# Altium project Camera-Controller-Board.PrjPcb (part 8 of 18)

## Sheet RK3588-OSC-PLL-PMUIO.SchDoc
size 420 x 297 mm; SheetNumber: 5; SheetTotal: 22
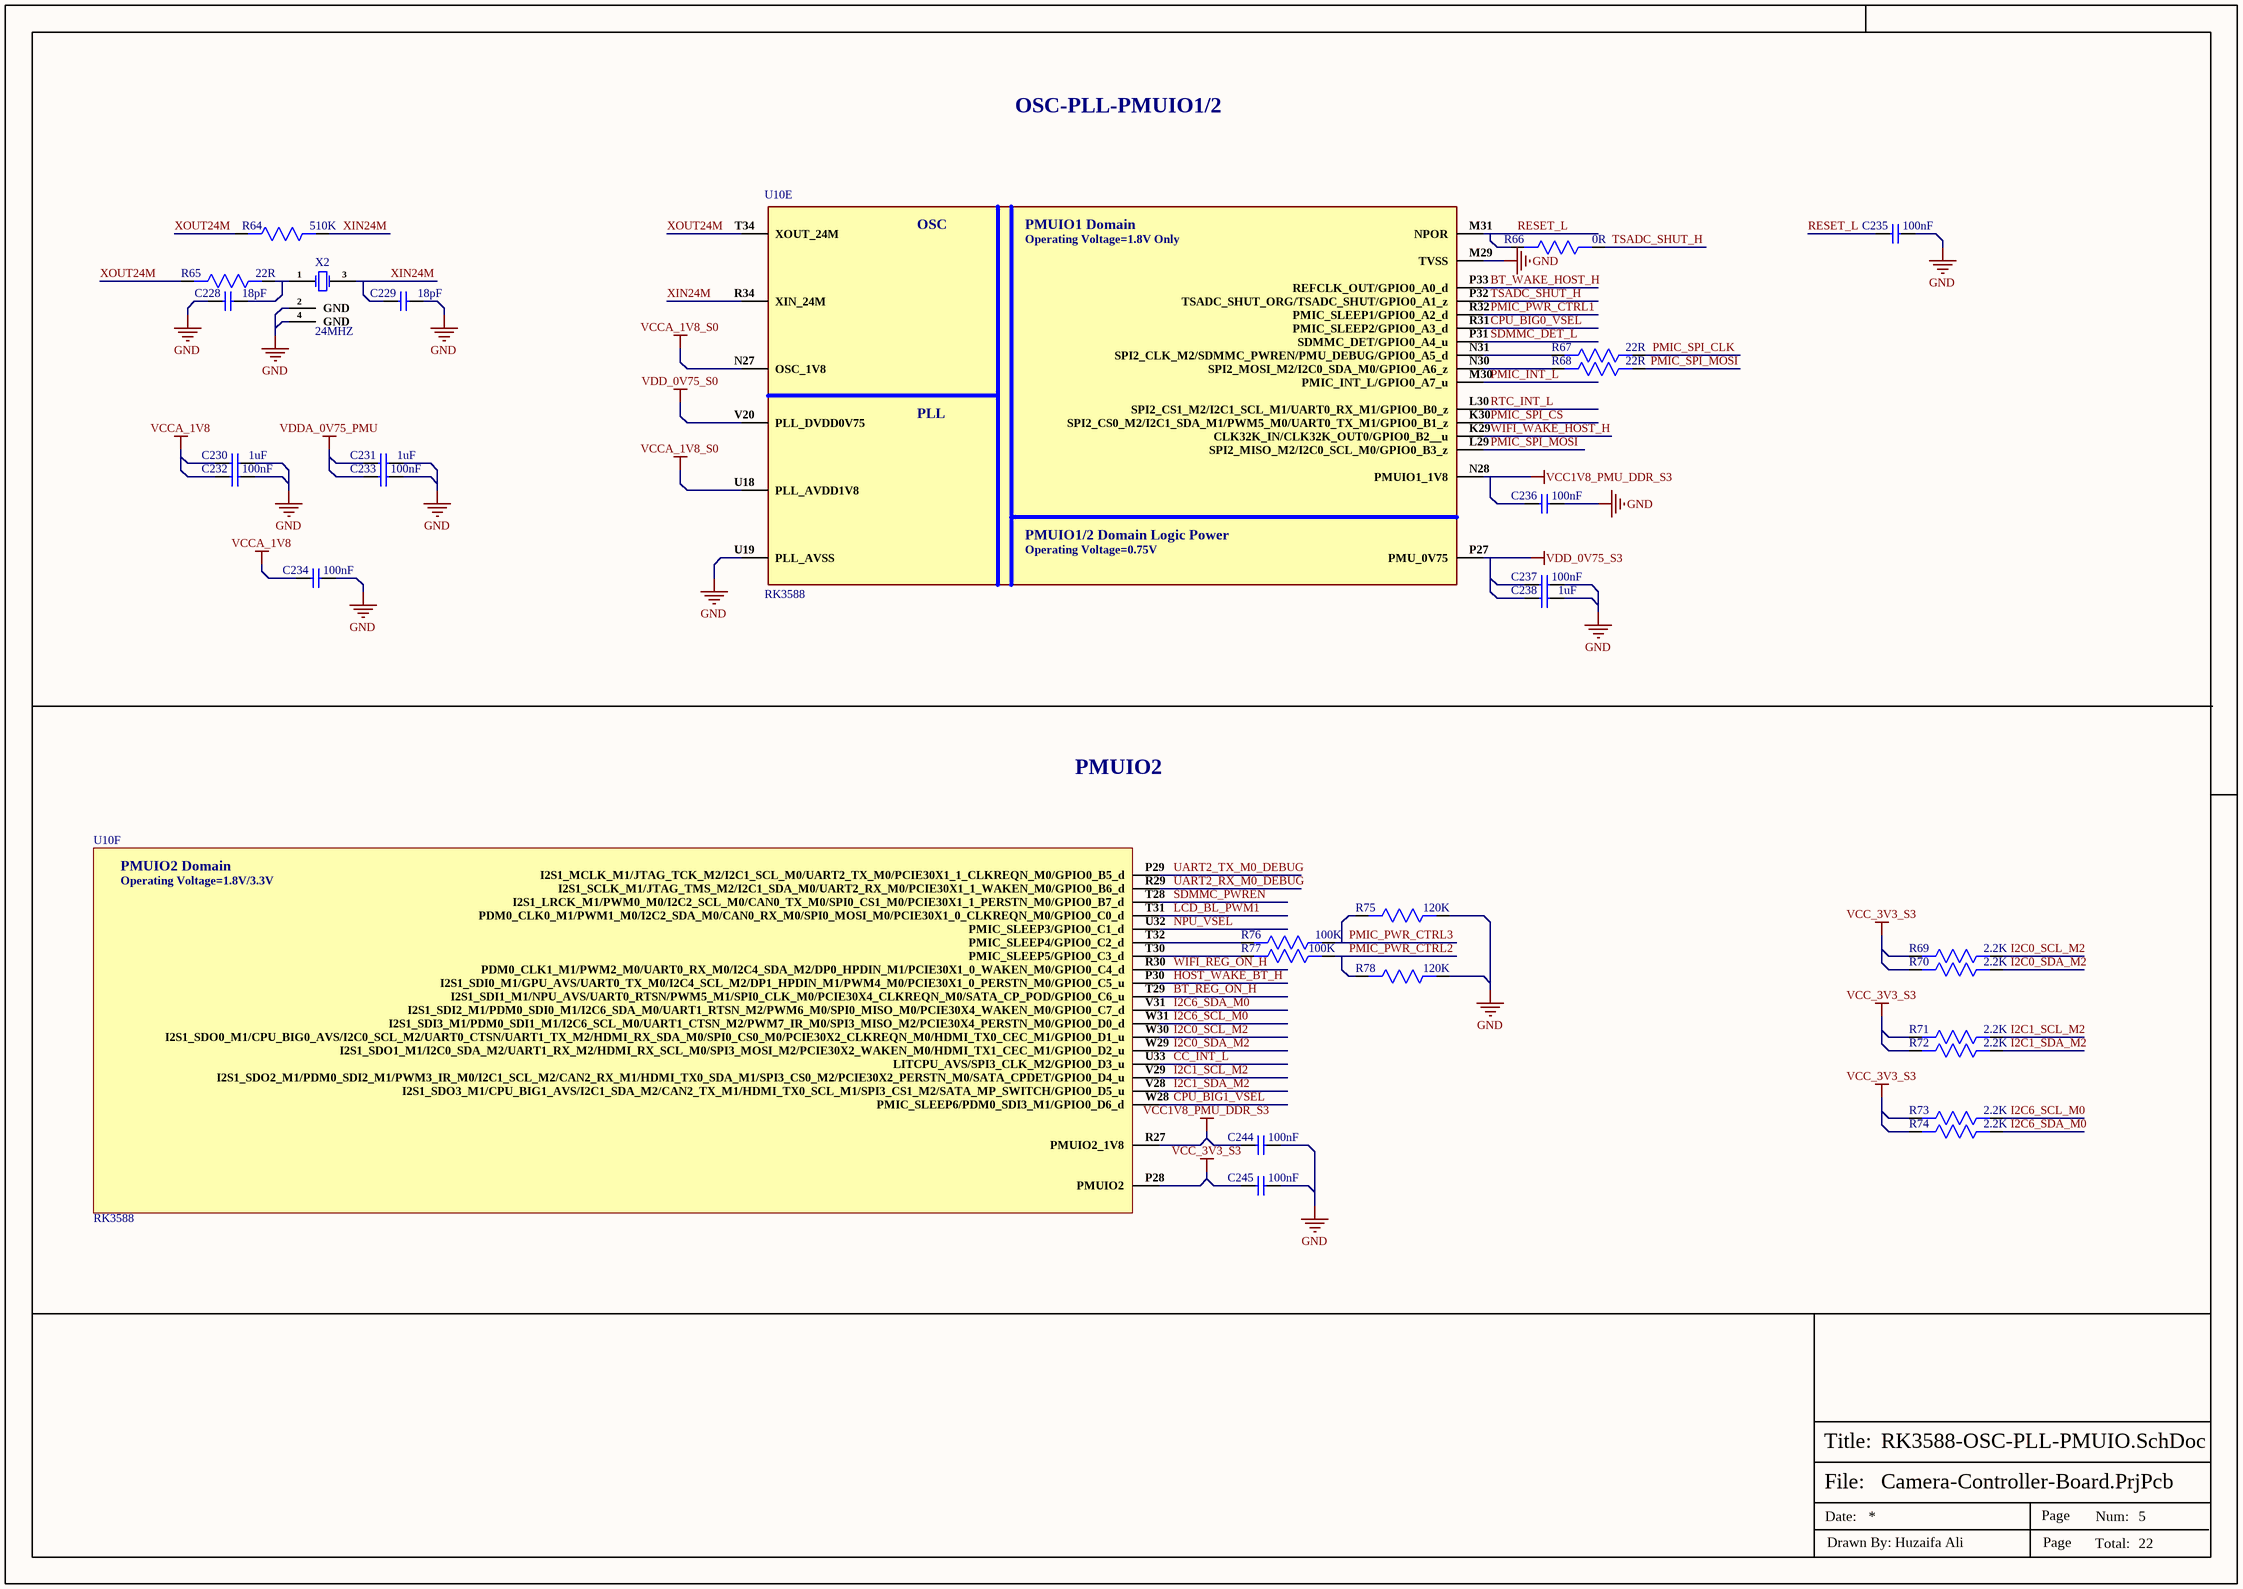
[diagram p4: RK3588-OSC-PLL-PMUIO.SchDoc]

### Parts
C228  18pF  [Cap-0402]
C229  18pF  [Cap-0402]
C230  1uF  [CAP-0201]
C231  1uF  [CAP-0201]
C232  100nF  [CAP-0201]
C233  100nF  [CAP-0201]
C234  100nF  [CAP-0201]
C235  100nF  [CAP-0201]
C236  100nF  [CAP-0201]
C237  100nF  [CAP-0201]
C238  1uF  [CAP-0201]
C244  100nF  [CAP-0201]
C245  100nF  [CAP-0201]
R64  510K  [Res-0402]
R65  22R  [Res-0402]
R66  0R  [Res-0201]
R67  22R  [Res-0402]
R68  22R  [Res-0402]
R69  2.2K  [Res-0201]
R70  2.2K  [Res-0201]
R71  2.2K  [Res-0201]
R72  2.2K  [Res-0201]
R73  2.2K  [Res-0201]
R74  2.2K  [Res-0201]
R75  120K  [Res-0402]
R76  100K  [Res-0402]
R77  100K  [Res-0402]
R78  120K  [Res-0402]
U10  RK3588  [FCBGA-1088L]  (parts E,F of 26)
X2  24MHZ  [X322524MOB4SI-]

### Nets
GND: C228.1 C229.2 C230.2 C231.2 C232.2 C233.2 C234.2 C235.2 C236.2 C237.2 C238.2 C244.2 C245.2 R75.1 R78.1 U10.M29(TVSS) U10.U19(PLL_AVSS) X2.2(GND) X2.4(GND)
VCC1V8_PMU_DDR_S3: C236.1 C244.1 U10.N28(PMUIO1_1V8) U10.R27(PMUIO2_1V8)
VCC_3V3_S3: C245.1 R69.2 R70.2 R71.2 R72.2 R73.2 R74.2 U10.P28(PMUIO2)
VCCA_1V8: C230.1 C232.1 C234.1
VCCA_1V8_S0: U10.N27(OSC_1V8) U10.U18(PLL_AVDD1V8)
VDD_0V75_S0: U10.V20(PLL_DVDD0V75)
VDD_0V75_S3: C237.1 C238.1 U10.P27(PMU_0V75)
VDDA_0V75_PMU: C231.1 C233.1
BT_REG_ON_H: U10.T29(I2S1_SDI1_M1/NPU_AVS/UART0_RTSN/PWM5_M1/SPI0_CLK_M0/PCIE30X4_CLKREQN_M0/SATA_CP_POD/GPIO0_C6_u)
BT_WAKE_HOST_H: U10.P33(REFCLK_OUT/GPIO0_A0_d)
CC_INT_L: U10.U33(LITCPU_AVS/SPI3_CLK_M2/GPIO0_D3_u)
CPU_BIG0_VSEL: U10.R31(PMIC_SLEEP2/GPIO0_A3_d)
CPU_BIG1_VSEL: U10.W28(PMIC_SLEEP6/PDM0_SDI3_M1/GPIO0_D6_d)
HOST_WAKE_BT_H: U10.P30(I2S1_SDI0_M1/GPU_AVS/UART0_TX_M0/I2C4_SCL_M2/DP1_HPDIN_M1/PWM4_M0/PCIE30X1_0_PERSTN_M0/GPIO0_C5_u)
I2C0_SCL_M2: R69.1 U10.W30(I2S1_SDO0_M1/CPU_BIG0_AVS/I2C0_SCL_M2/UART0_CTSN/UART1_TX_M2/HDMI_RX_SDA_M0/SPI0_CS0_M0/PCIE30X2_CLKREQN_M0/HDMI_TX0_CEC_M1/GPIO0_D1_u)
I2C0_SDA_M2: R70.1 U10.W29(I2S1_SDO1_M1/I2C0_SDA_M2/UART1_RX_M2/HDMI_RX_SCL_M0/SPI3_MOSI_M2/PCIE30X2_WAKEN_M0/HDMI_TX1_CEC_M1/GPIO0_D2_u)
I2C1_SCL_M2: R71.1 U10.V29(I2S1_SDO2_M1/PDM0_SDI2_M1/PWM3_IR_M0/I2C1_SCL_M2/CAN2_RX_M1/HDMI_TX0_SDA_M1/SPI3_CS0_M2/PCIE30X2_PERSTN_M0/SATA_CPDET/GPIO0_D4_u)
I2C1_SDA_M2: R72.1 U10.V28(I2S1_SDO3_M1/CPU_BIG1_AVS/I2C1_SDA_M2/CAN2_TX_M1/HDMI_TX0_SCL_M1/SPI3_CS1_M2/SATA_MP_SWITCH/GPIO0_D5_u)
I2C6_SCL_M0: R73.1 U10.W31(I2S1_SDI3_M1/PDM0_SDI1_M1/I2C6_SCL_M0/UART1_CTSN_M2/PWM7_IR_M0/SPI3_MISO_M2/PCIE30X4_PERSTN_M0/GPIO0_D0_d)
I2C6_SDA_M0: R74.1 U10.V31(I2S1_SDI2_M1/PDM0_SDI0_M1/I2C6_SDA_M0/UART1_RTSN_M2/PWM6_M0/SPI0_MISO_M0/PCIE30X4_WAKEN_M0/GPIO0_C7_d)
LCD_BL_PWM1: U10.T31(PDM0_CLK0_M1/PWM1_M0/I2C2_SDA_M0/CAN0_RX_M0/SPI0_MOSI_M0/PCIE30X1_0_CLKREQN_M0/GPIO0_C0_d)
NPU_VSEL: U10.U32(PMIC_SLEEP3/GPIO0_C1_d)
PMIC_INT_L: U10.M30(PMIC_INT_L/GPIO0_A7_u)
PMIC_PWR_CTRL1: U10.R32(PMIC_SLEEP1/GPIO0_A2_d)
PMIC_PWR_CTRL2: R77.1 R78.2
PMIC_PWR_CTRL3: R75.2 R76.1
PMIC_SPI_CLK: R67.1
PMIC_SPI_CS: U10.K30(SPI2_CS0_M2/I2C1_SDA_M1/PWM5_M0/UART0_TX_M1/GPIO0_B1_z)
PMIC_SPI_MOSI: R68.1 U10.L29(SPI2_MISO_M2/I2C0_SCL_M0/GPIO0_B3_z)
RESET_L: C235.1 R66.2 U10.M31(NPOR)
RTC_INT_L: U10.L30(SPI2_CS1_M2/I2C1_SCL_M1/UART0_RX_M1/GPIO0_B0_z)
SDMMC_DET_L: U10.P31(SDMMC_DET/GPIO0_A4_u)
SDMMC_PWREN: U10.T28(I2S1_LRCK_M1/PWM0_M0/I2C2_SCL_M0/CAN0_TX_M0/SPI0_CS1_M0/PCIE30X1_1_PERSTN_M0/GPIO0_B7_d)
TSADC_SHUT_H: R66.1 U10.P32(TSADC_SHUT_ORG/TSADC_SHUT/GPIO0_A1_z)
UART2_RX_M0_DEBUG: U10.R29(I2S1_SCLK_M1/JTAG_TMS_M2/I2C1_SDA_M0/UART2_RX_M0/PCIE30X1_1_WAKEN_M0/GPIO0_B6_d)
UART2_TX_M0_DEBUG: U10.P29(I2S1_MCLK_M1/JTAG_TCK_M2/I2C1_SCL_M0/UART2_TX_M0/PCIE30X1_1_CLKREQN_M0/GPIO0_B5_d)
WIFI_REG_ON_H: U10.R30(PDM0_CLK1_M1/PWM2_M0/UART0_RX_M0/I2C4_SDA_M2/DP0_HPDIN_M1/PCIE30X1_0_WAKEN_M0/GPIO0_C4_d)
WIFI_WAKE_HOST_H: U10.K29(CLK32K_IN/CLK32K_OUT0/GPIO0_B2__u)
XIN24M: C229.1 R64.1 U10.R34(XIN_24M) X2.3(CRYSTAL)
XOUT24M: R64.2 R65.2 U10.T34(XOUT_24M)
NetC228_2: C228.2 R65.1 X2.1(CRYSTAL)
NetR67_2: R67.2 U10.N31(SPI2_CLK_M2/SDMMC_PWREN/PMU_DEBUG/GPIO0_A5_d)
NetR68_2: R68.2 U10.N30(SPI2_MOSI_M2/I2C0_SDA_M0/GPIO0_A6_z)
NetR76_2: R76.2 U10.T32(PMIC_SLEEP4/GPIO0_C2_d)
NetR77_2: R77.2 U10.T30(PMIC_SLEEP5/GPIO0_C3_d)

### Notes on the sheet
- OSC-PLL-PMUIO1/2
- PMUIO2
- File:
- Title:
- Date:
- Page
- Num:
- Total:
- Drawn By: Huzaifa Ali
- (in symbol RK3588, part E) OSC; PMUIO1 Domain; Operating Voltage=1.8V Only; PLL; PMUIO1/2 Domain Logic Power; Operating Voltage=0.75V
- (in symbol RK3588, part F) PMUIO2 Domain; Operating Voltage=1.8V/3.3V

### Library data of the parts
C228 C229 = GRM1555C1H180FA01D: CAP CER 18PF 50V C0G/NP0 0402; Manufacturer: Murata; Material: Ceramic; Tolerance: 1%; Dielectric: C0G; Temperature Coefficient: 30ppm/°C; Supplier 1: Digi-Key; Manufacturer Part Number: GRM1555C1H180FA01D; RoHS: Yes; Category: Ceramic Capacitors; Stock 1: 2076194; Pricing 1: 1=0.10000, 10=0.06400, 50=0.03500, 100=0.02860, 500=0.02040, 1000=0.01603, 2500=0.01458, 5000=0.01341 (USD); Mount: Surface Mount; Case/Package: 0402; Case Code (Metric): 1005; Case Code (Imperial): 0402; Min Operating Temperature: -55°C; Max Operating Temperature: 125°C; Package Quantity: 1; Capacitance: 18pF; Voltage Rating: 50V; Packaging: Tape and Reel; Voltage Rating (DC): 50V; Termination: SMD/SMT; Voltage: 50V; Series: GRM; Construction: Flat; Length: 1mm; Width: 0.5mm; Height: 0.5mm; Thickness: 0.022inch; Depth: 0.5mm; Radiation Hardening: No; Reach SVHC Compliant: Yes; Lead Free: Lead Free; RoHS Compliant: Yes; ComponentLink1URL: https://datasheet.ciiva.com/11789/0900766b80ef921d-11789068.pdf?src-supplier=RSComponents; ComponentLink1Description: https://datasheet.ciiva.com/11789/0900766b80ef921d-11789068.pdf?src-supplier=RSComponents; ComponentLink2URL: https://datasheet.ciiva.com/6270/partnumbering-e-01-6270797.pdf?src-supplier=Digi-Key; ComponentLink2Description: https://datasheet.ciiva.com/6270/partnumbering-e-01-6270797.pdf?src-supplier=Digi-Key; Supplier Part Number 1: 490-6203-1-ND
C230 C231 C238 = CC0201KRX5R5BB105: CAP CER 1UF 6.3V X5R 0201; Manufacturer: Yageo; Tolerance: 10%; Supplier 1: Digi-Key; Manufacturer Part Number: CC0201KRX5R5BB105; RoHS: Yes; Category: Ceramic Capacitors; Stock 1: 1909543; Pricing 1: 1=0.10000, 10=0.04600, 50=0.02500, 100=0.02050, 500=0.01464, 1000=0.01150, 2500=0.01045, 5000=0.00962 (USD); Mount: Surface Mount; Case/Package: 0201; Case Code (Imperial): 0201; Case Code (Metric): 0603; Min Operating Temperature: -55°C; Max Operating Temperature: 85°C; Packaging: Cut Tape; Capacitance: 1uF; Voltage Rating: 6.3V; RoHS Compliant: Yes; ComponentLink1URL: http://www.yageo.com/documents/recent/UPY-GPHC_X5R_4V-to-50V_25.pdf?src-supplier=Digi-Key; ComponentLink1Description: http://www.yageo.com/documents/recent/UPY-GPHC_X5R_4V-to-50V_25.pdf?src-supplier=Digi-Key; ComponentLink2URL: https://www.yageo.com/upload/media/product/productsearch/datasheet/mlcc/UPY-GPHC_X5R_4V-to-50V_26.pdf?src-supplier=Digi-Key; ComponentLink2Description: https://www.yageo.com/upload/media/product/productsearch/datasheet/mlcc/UPY-GPHC_X5R_4V-to-50V_26.pdf?src-supplier=Digi-Key; Supplier Part Number 1: 311-3471-1-ND
C232-C237 = CC0201KRX5R6BB104: CAP CER 0.1UF 10V X5R 0201; Manufacturer: Yageo; Tolerance: 10%; Supplier 1: Mouser; Manufacturer Part Number: CC0201KRX5R6BB104; RoHS: Yes; Category: Ceramic Capacitors; Stock 1: 824403; Pricing 1: 1=0.10000, 10=0.02400, 50=0.02400, 100=0.01900, 1000=0.01100, 10000=0.00900 (USD); Mount: Surface Mount; Case/Package: 0201; Case Code (Imperial): 0201; Case Code (Metric): 0603; Weight: 6E-06oz; Min Operating Temperature: -55°C; Max Operating Temperature: 85°C; Capacitance: 100nF; Dielectric: X5R; Voltage Rating (DC): 10V; Packaging: Tape and Reel; Termination: SMD/SMT; Resistor Type: Ceramic; Voltage Rating: 10V; Series: CC; Construction: Flat; Length: 0.6mm; Width: 0.012inch; Height: 0.3mm; Thickness: 0.013inch; Depth: 0.3mm; Radiation Hardening: No; Lead Free: Lead Free; Halogen Free: Halogen Free; RoHS Compliant: Yes; ComponentLink1URL: https://datasheet.ciiva.com/11587/upy-gphc-x5r-4v-to-50v-12-11587190.pdf?src-supplier=Avnet; ComponentLink1Description: https://datasheet.ciiva.com/11587/upy-gphc-x5r-4v-to-50v-12-11587190.pdf?src-supplier=Avnet; Supplier Part Number 1: 603-CC201KRX5R6BB104; LCSC Part Number: C190183
C244 C245 = CC0201KRX5R5BB104: CAP CER 0.1UF 6.3V X5R 0201; Manufacturer: Yageo; Tolerance: 10%; Supplier 1: Digi-Key; Manufacturer Part Number: CC0201KRX5R5BB104; RoHS: Yes; Category: Ceramic Capacitors; Stock 1: 3711589; Pricing 1: 1=0.10000, 10=0.02100, 50=0.01160, 100=0.00960, 500=0.00682, 1000=0.00536, 2500=0.00487, 5000=0.00448 (USD); Mount: Surface Mount; Case/Package: 0201; Number of Pins: 2; Case Code (Imperial): 0201; Case Code (Metric): 0603; Min Operating Temperature: -55°C; Max Operating Temperature: 85°C; Capacitance: 100nF; Dielectric: X5R; Voltage Rating: 6.3V; Packaging: Tape and Reel; Package Quantity: 1; Voltage Rating (DC): 6.3V; Termination: SMD/SMT; Resistor Type: Ceramic; Series: CC; Length: 0.6mm; Width: 0.012inch; Height: 0.3mm; Thickness: 0.013inch; Depth: 0.3mm; Reach SVHC Compliant: Yes; Lead Free: Lead Free; Halogen Free: Halogen Free; RoHS Compliant: Yes; ComponentLink1URL: https://datasheet.ciiva.com/7656/1525783-7656597.pdf?src-supplier=Element14; ComponentLink1Description: https://datasheet.ciiva.com/7656/1525783-7656597.pdf?src-supplier=Element14; ComponentLink2URL: https://datasheet.ciiva.com/28450/1359354-28450200.pdf?src-supplier=Element14; ComponentLink2Description: https://datasheet.ciiva.com/28450/1359354-28450200.pdf?src-supplier=Element14; ComponentLink3URL: https://datasheet.ciiva.com/176/mlccorderingcode-176766.pdf?src-supplier=Digi-Key; ComponentLink3Description: https://datasheet.ciiva.com/176/mlccorderingcode-176766.pdf?src-supplier=Digi-Key; ComponentLink4URL: https://datasheet.ciiva.com/176/mlccorderingcode-176765.pdf?src-supplier=Digi-Key; ComponentLink4Description: https://datasheet.ciiva.com/176/mlccorderingcode-176765.pdf?src-supplier=Digi-Key; ComponentLink5URL: https://datasheet.ciiva.com/176/mlccorderingcode-176767.pdf?src-supplier=Digi-Key; ComponentLink5Description: https://datasheet.ciiva.com/176/mlccorderingcode-176767.pdf?src-supplier=Digi-Key; Supplier Part Number 1: 311-1408-1-ND
R64 = RC0402FR-07510KL: RES 510K OHM 1% 1/16W 0402; Manufacturer: Yageo; Power Rating: 63mW; Voltage Rating: 50V; Resistance: 510kR; Temperature Coefficient: 100ppm/°C; Supplier 1: Digi-Key; Manufacturer Part Number: RC0402FR-07510KL; RoHS: Yes; Category: Chip SMD Resistors; Stock 1: 127289; Pricing 1: 1=0.10000, 10=0.01400, 100=0.00580, 1000=0.00262, 2500=0.00228, 5000=0.00188 (USD); Case/Package: 0402; Case Code (Imperial): 0402; Case Code (Metric): 1005; Size Code: 0402; Min Operating Temperature: -55°C; Max Operating Temperature: 155°C; Tolerance: 1%; Packaging: Tape and Reel; Package Quantity: 1; Termination: SMD/SMT; Resistor Type: Thick Film; Number of Terminations: 2; Max Power Dissipation: 63mW; Voltage Rating (DC): 50V; Features: Moisture Resistant; Series: RC; Construction: Rectangular; Resistance Tolerance: 1%; Technology: THICK FILM; Length: 1mm; Width: 0.02inch; Height: 0.016inch; Depth: 0.5mm; Military Standard: Not; Lead Free: Lead Free; RoHS Compliant: Yes; ComponentLink1URL: https://datasheet.ciiva.com/11808/0900766b80c66297-11808810.pdf?src-supplier=RSComponents; ComponentLink1Description: https://datasheet.ciiva.com/11808/0900766b80c66297-11808810.pdf?src-supplier=RSComponents; ComponentLink2URL: https://datasheet.ciiva.com/2453/pyu-r-int-thick-7-2453464.pdf?src-supplier=Digi-Key; ComponentLink2Description: https://datasheet.ciiva.com/2453/pyu-r-int-thick-7-2453464.pdf?src-supplier=Digi-Key; ComponentLink3URL: https://datasheet.ciiva.com/2453/pyu-r-int-thick-7-2453465.pdf?src-supplier=Digi-Key; ComponentLink3Description: https://datasheet.ciiva.com/2453/pyu-r-int-thick-7-2453465.pdf?src-supplier=Digi-Key; ComponentLink4URL: https://datasheet.ciiva.com/2453/pyu-r-int-thick-7-2453463.pdf?src-supplier=Digi-Key; ComponentLink4Description: https://datasheet.ciiva.com/2453/pyu-r-int-thick-7-2453463.pdf?src-supplier=Digi-Key; ComponentLink5URL: https://datasheet.ciiva.com/17419/pyu-rc0402-51-rohs-l-6-r-17419596.pdf?src-supplier=Future+Electronics; ComponentLink5Description: https://datasheet.ciiva.com/17419/pyu-rc0402-51-rohs-l-6-r-17419596.pdf?src-supplier=Future+Electronics; Supplier Part Number 1: 311-510KLRCT-ND
R65 R67 R68 = RCS040222R0FKED: RES SMD 22 OHM 1% 1/5W 0402; Manufacturer: Vishay Dale; Max Power Dissipation: 200mW; Temperature Coefficient: 100ppm/°C; Supplier 1: Digi-Key; Manufacturer Part Number: RCS040222R0FKED; Stock 1: 8456; Pricing 1: 1=0.12, 10=0.105, 100=0.0402, 1000=0.01771, 2500=0.0153, 5000=0.01368 (USD); Case/Package: 0402; Case Code (Metric): 1005; Case Code (Imperial): 0402; Min Operating Temperature: -55°C; Max Operating Temperature: 155°C; Packaging: Tape and Reel; Resistance: 22R; Resistor Type: Thick Film; Number of Terminations: 2; Tolerance: 1%; Features: Automotive AEC-Q200; Length: 0.039inch; Width: 0.02inch; Height: 0.016inch; RoHS Compliant: Yes; ComponentLink1URL: http://www.vishay.com/docs/20065/rcse3.pdf?src-supplier=Digi-Key; ComponentLink1Description: http://www.vishay.com/docs/20065/rcse3.pdf?src-supplier=Digi-Key; Supplier Part Number 1: 541-2880-1-ND; LCSC Part Number: C2086081
R66 = RC0201JR-070RL: RES SMD 0 OHM JUMPER 1/20W 0201; Manufacturer: Yageo; Power Rating: 50mW; Tolerance: 5%; Voltage Rating: 25V; Supplier 1: Digi-Key; Manufacturer Part Number: RC0201JR-070RL; RoHS: Yes; Category: Chip SMD Resistors; Stock 1: 11079; Pricing 1: 1=0.10000, 10=0.03600, 25=0.02640, 50=0.02000, 100=0.01480, 250=0.01128, 500=0.00904, 1000=0.00665, 5000=0.00477 (USD); Case/Package: 0201; Contact Plating: Tin,Matte; Case Code (Metric): 0603; Case Code (Imperial): 0201; Weight: 6E-06oz; Size Code: 0201; Min Operating Temperature: -55°C; Max Operating Temperature: 125°C; Resistor Type: Thick Film; Resistance: 0R; Packaging: Tape and Reel; Package Quantity: 10000; Number of Terminations: 2; Termination: SMD/SMT; Max Power Dissipation: 50mW; Voltage Rating (DC): 25V; Features: Moisture Resistant; Series: RC; Construction: Rectangular; Resistance Tolerance: 5%; Length: 0.6mm; Width: 0.012inch; Height: 0.01inch; Depth: 0.3mm; Radiation Hardening: No; RoHS Compliant: Yes; REACH SVHC: Unknown; Military Standard: Not; Lead Free: Lead Free; ComponentLink1URL: https://datasheet.ciiva.com/7672/1563626-7672247.pdf?src-supplier=Element14; ComponentLink1Description: https://datasheet.ciiva.com/7672/1563626-7672247.pdf?src-supplier=Element14; ComponentLink2URL: https://datasheet.ciiva.com/7660/1421516-7660808.pdf?src-supplier=Element14; ComponentLink2Description: https://datasheet.ciiva.com/7660/1421516-7660808.pdf?src-supplier=Element14; ComponentLink3URL: https://datasheet.ciiva.com/7672/1563626-7672248.pdf?src-supplier=Element14; ComponentLink3Description: https://datasheet.ciiva.com/7672/1563626-7672248.pdf?src-supplier=Element14; ComponentLink4URL: https://datasheet.ciiva.com/16855/pyu-rc0201-51-rohs-l-8-16855994.pdf?src-supplier=Avnet+Europe; ComponentLink4Description: https://datasheet.ciiva.com/16855/pyu-rc0201-51-rohs-l-8-16855994.pdf?src-supplier=Avnet+Europe; ComponentLink5URL: https://datasheet.ciiva.com/28419/pyu-rc0201-51-rohs-l-8-28419660.pdf?src-supplier=Avnet+Europe; ComponentLink5Description: https://datasheet.ciiva.com/28419/pyu-rc0201-51-rohs-l-8-28419660.pdf?src-supplier=Avnet+Europe; ComponentLink6URL: https://datasheet.ciiva.com/46391/1421516-46391340.pdf?src-supplier=Element14; ComponentLink6Description: https://datasheet.ciiva.com/46391/1421516-46391340.pdf?src-supplier=Element14; ComponentLink7URL: https://datasheet.ciiva.com/8896/pyu-rc0201-51-rohs-l-8-8896143.pdf?src-supplier=Avnet; ComponentLink7Description: https://datasheet.ciiva.com/8896/pyu-rc0201-51-rohs-l-8-8896143.pdf?src-supplier=Avnet; Supplier Part Number 1: 311-0.0NCT-ND; LCSC Part Number: C106228
R69-R74 = RC0201FR-072K2L: RES 2.2K OHM 1% 1/20W 0201; Manufacturer: Yageo; Resistance: 2.2kR; Power Rating: 50mW; Voltage Rating: 25V; Temperature Coefficient: 200ppm/°C; Supplier 1: Digi-Key; Manufacturer Part Number: RC0201FR-072K2L; RoHS: Yes; Category: Chip SMD Resistors; Stock 1: 1171924; Pricing 1: 1=0.10000, 10=0.03700, 100=0.01500, 1000=0.00672, 2500=0.00583, 5000=0.00482 (USD); Case/Package: 0201; Case Code (Imperial): 0201; Case Code (Metric): 0603; Size Code: 0201; Min Operating Temperature: -55°C; Max Operating Temperature: 125°C; Tolerance: 1%; Packaging: Tape and Reel; Resistor Type: Thick Film; Number of Terminations: 2; Termination: SMD/SMT; Max Power Dissipation: 50mW; Features: Moisture Resistant; Series: RC; Resistance Tolerance: 1%; Construction: Rectangular; Length: 0.024inch; Width: 0.3mm; Height: 0.01inch; Depth: 0.3mm; Military Standard: Not; Lead Free: Lead Free; RoHS Compliant: Yes; ComponentLink1URL: https://datasheet.ciiva.com/7672/1563626-7672218.pdf?src-supplier=Element14; ComponentLink1Description: https://datasheet.ciiva.com/7672/1563626-7672218.pdf?src-supplier=Element14; Supplier Part Number 1: YAG2572CT-ND
R75 R78 = RC0402FR-07120KL: RES 120K OHM 1% 1/16W 0402; Manufacturer: Yageo; Resistance: 120kR; Power Rating: 63mW; Voltage Rating: 50V; Temperature Coefficient: 100ppm/°C; Item Type: Resistor; Supplier 1: Avnet; Manufacturer Part Number: RC0402FR-07120KL; RoHS: Yes; Category: Chip SMD Resistors; Stock 1: 12000; Pricing 1: 10000=0.00085 (USD); Case/Package: 0402; Case Code (Imperial): 0402; Case Code (Metric): 1005; Weight: 2.3E-05oz; Min Operating Temperature: -55°C; Max Operating Temperature: 155°C; Tolerance: 1%; Packaging: Tape and Reel; Package Quantity: 1; Termination: SMD/SMT; Resistor Type: Thick Film; Number of Terminations: 2; Max Power Dissipation: 63mW; Working Voltage: 50V; Features: Moisture Resistant; Series: RC; Resistance Tolerance: 1%; Technology: THICK FILM; Construction: Rectangular; Length: 1mm; Width: 0.02inch; Height: 0.016inch; Depth: 0.5mm; Military Standard: Not; Lead Free: Lead Free; RoHS Compliant: Yes; ComponentLink1URL: https://datasheet.ciiva.com/11808/0900766b80c66297-11808308.pdf?src-supplier=RSComponents; ComponentLink1Description: https://datasheet.ciiva.com/11808/0900766b80c66297-11808308.pdf?src-supplier=RSComponents; ComponentLink2URL: https://datasheet.ciiva.com/2453/pyu-r-int-thick-7-2453518.pdf?src-supplier=Digi-Key; ComponentLink2Description: https://datasheet.ciiva.com/2453/pyu-r-int-thick-7-2453518.pdf?src-supplier=Digi-Key; ComponentLink3URL: https://datasheet.ciiva.com/2453/pyu-r-int-thick-7-2453519.pdf?src-supplier=Digi-Key; ComponentLink3Description: https://datasheet.ciiva.com/2453/pyu-r-int-thick-7-2453519.pdf?src-supplier=Digi-Key; ComponentLink4URL: https://datasheet.ciiva.com/2453/pyu-r-int-thick-7-2453517.pdf?src-supplier=Digi-Key; ComponentLink4Description: https://datasheet.ciiva.com/2453/pyu-r-int-thick-7-2453517.pdf?src-supplier=Digi-Key; ComponentLink5URL: https://datasheet.ciiva.com/12577/pyu-rc0402-51-rohs-l-6-r-12577334.pdf?src-supplier=Mouser; ComponentLink5Description: https://datasheet.ciiva.com/12577/pyu-rc0402-51-rohs-l-6-r-12577334.pdf?src-supplier=Mouser; ComponentLink6URL: https://datasheet.ciiva.com/7849/1018594-7849829.pdf?src-supplier=Element14; ComponentLink6Description: https://datasheet.ciiva.com/7849/1018594-7849829.pdf?src-supplier=Element14; ComponentLink7URL: https://datasheet.ciiva.com/16741/pyu-rc0402-51-rohs-l-6-r-16741433.pdf?src-supplier=Future+Electronics; ComponentLink7Description: https://datasheet.ciiva.com/16741/pyu-rc0402-51-rohs-l-6-r-16741433.pdf?src-supplier=Future+Electronics; Supplier Part Number 1: RC0402FR-07120KL; LCSC Part Number: C93945
R76 R77 = RC0402FR-07100KL: RES 100K OHM 1% 1/16W 0402; Manufacturer: Yageo; Resistance: 100kR; Temperature Coefficient: 100ppm/°C; Power Rating: 63mW; Voltage Rating: 50V; Supplier 1: Mouser; Manufacturer Part Number: RC0402FR-07100KL; RoHS: Yes; Category: Chip SMD Resistors; Stock 1: 7759549; Pricing 1: 1=0.10000, 10=0.01200, 50=0.01200, 100=0.00500, 1000=0.00300, 2500=0.00200, 10000=0.00100 (USD); Case/Package: 0402; Case Code (Metric): 1005; Case Code (Imperial): 0402; Min Operating Temperature: -55°C; Max Operating Temperature: 155°C; Resistor Type: Thick Film; Tolerance: 1%; Packaging: Tape and Reel; Package Quantity: 1; Number of Terminations: 2; Termination: SMD/SMT; Max Power Dissipation: 63mW; Working Voltage: 50V; Features: Moisture Resistant; Series: RC; Resistance Tolerance: 1%; Construction: Rectangular; Technology: THICK FILM; Length: 0.039inch; Width: 0.02inch; Height: 0.016inch; Depth: 0.5mm; REACH SVHC: No SVHC; Lead Free: Lead Free; RoHS Compliant: Yes; Military Standard: Not; ComponentLink1URL: https://datasheet.ciiva.com/11819/0900766b80c66297-11819452.pdf?src-supplier=RSComponents; ComponentLink1Description: https://datasheet.ciiva.com/11819/0900766b80c66297-11819452.pdf?src-supplier=RSComponents; ComponentLink2URL: https://datasheet.ciiva.com/22747/1018594-22747509.pdf?src-supplier=Element14; ComponentLink2Description: https://datasheet.ciiva.com/22747/1018594-22747509.pdf?src-supplier=Element14; ComponentLink3URL: https://datasheet.ciiva.com/2453/pyu-r-int-thick-7-2453362.pdf?src-supplier=Digi-Key; ComponentLink3Description: https://datasheet.ciiva.com/2453/pyu-r-int-thick-7-2453362.pdf?src-supplier=Digi-Key; ComponentLink4URL: https://datasheet.ciiva.com/2453/pyu-r-int-thick-7-2453363.pdf?src-supplier=Digi-Key; ComponentLink4Description: https://datasheet.ciiva.com/2453/pyu-r-int-thick-7-2453363.pdf?src-supplier=Digi-Key; ComponentLink5URL: https://datasheet.ciiva.com/2453/pyu-r-int-thick-7-2453361.pdf?src-supplier=Digi-Key; ComponentLink5Description: https://datasheet.ciiva.com/2453/pyu-r-int-thick-7-2453361.pdf?src-supplier=Digi-Key; ComponentLink6URL: https://datasheet.ciiva.com/12667/pyu-rc0402-51-rohs-l-6-r-12667930.pdf?src-supplier=Mouser; ComponentLink6Description: https://datasheet.ciiva.com/12667/pyu-rc0402-51-rohs-l-6-r-12667930.pdf?src-supplier=Mouser; ComponentLink7URL: https://datasheet.ciiva.com/15189/getdatasheetpartid-323696-15189334.pdf?src-supplier=Verical; ComponentLink7Description: https://datasheet.ciiva.com/15189/getdatasheetpartid-323696-15189334.pdf?src-supplier=Verical; Supplier Part Number 1: 603-RC0402FR-07100KL
U10 = RK3588: Power Management IC; Manufacturer Part Number: RK3588LP4XEVB; Manufacturer: Rockchip; LCSC Part Number: *; Item Type: IC
X2 = X322524MOB4SI: 24MHz SMD Crystal Resonator 12pF ±10ppm ±30ppm -40℃~+85℃ SMD3225-4P Crystals ROHS; Manufacturer: Yangxing Tech; ComponentLink1Description: LCSC; ComponentLink1URL: https://www.lcsc.com/product-detail/Crystals_Yangxing-Tech-X322524MOB4SI_C70590.html; Manufacturer Part Number: X322524MOB4SI; Footprint: Custom; LCSC Part Number: C70590

## Sheet RK3588-DDR-Controller.SchDoc
size 420 x 297 mm; SheetNumber: 6; SheetTotal: 22
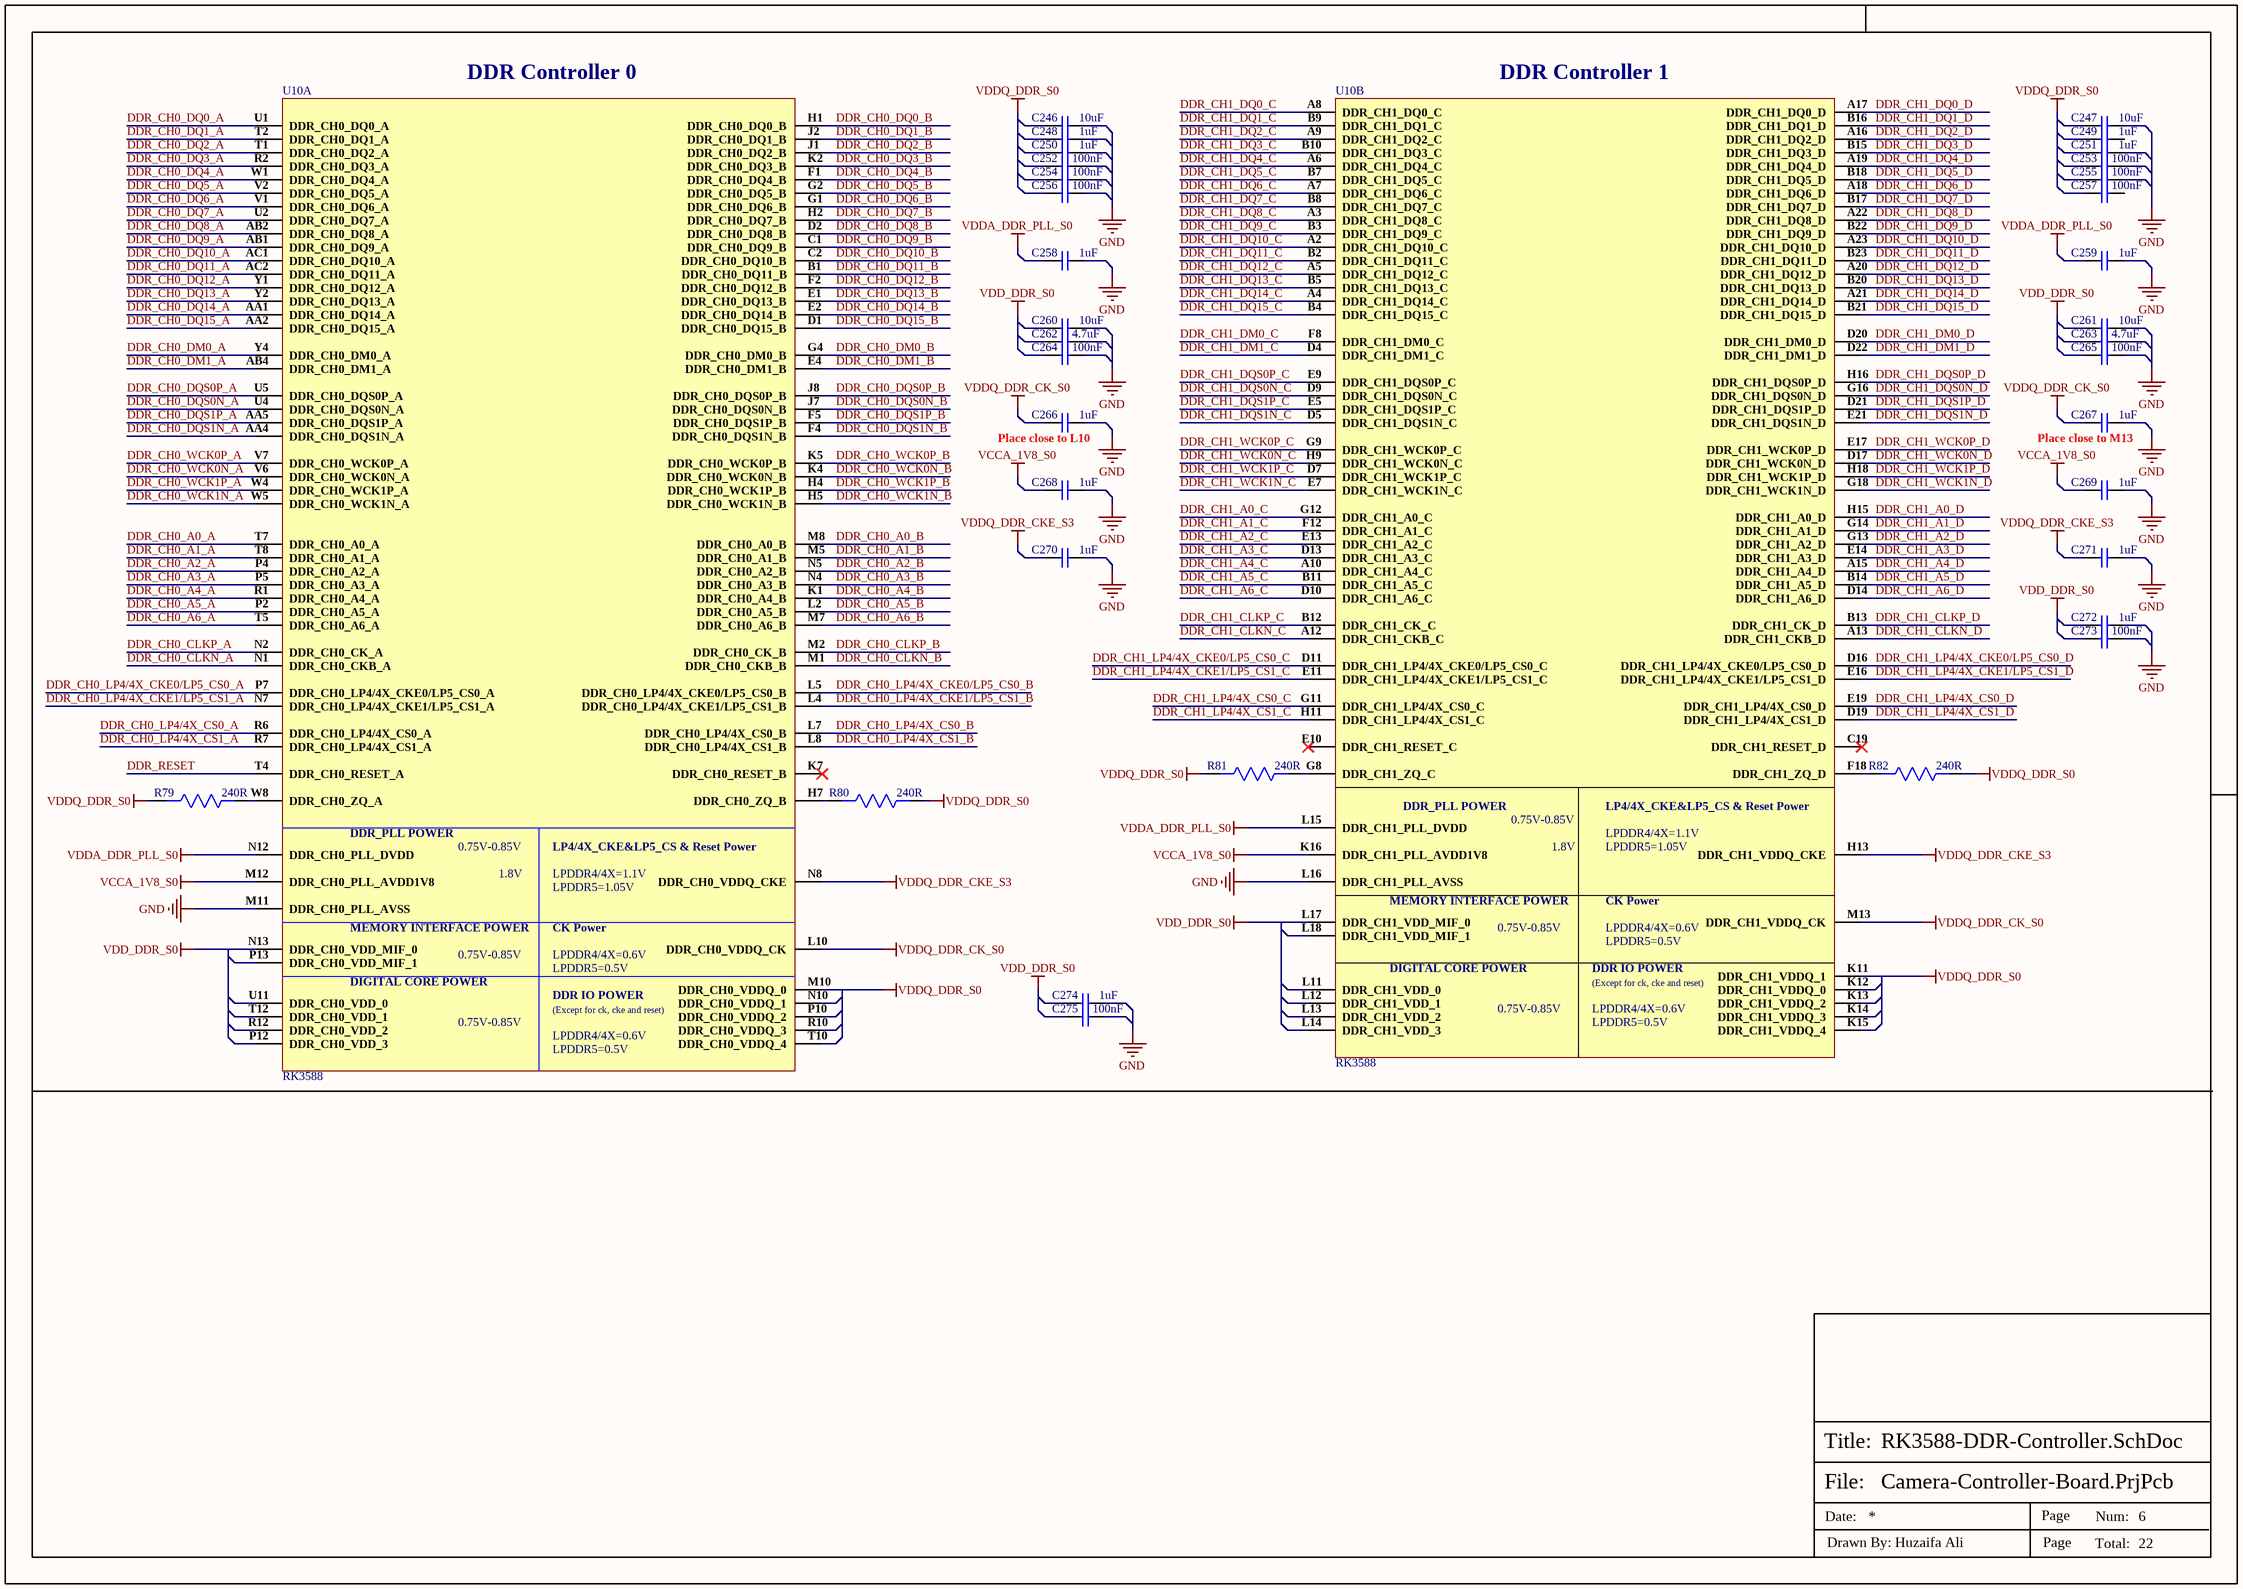
[diagram p5: RK3588-DDR-Controller.SchDoc]

### Parts
C246  10uF  [Cap-0402]
C247  10uF  [Cap-0402]
C248  1uF  [CAP-0201]
C249  1uF  [CAP-0201]
C250  1uF  [CAP-0201]
C251  1uF  [CAP-0201]
C252  100nF  [CAP-0201]
C253  100nF  [CAP-0201]
C254  100nF  [CAP-0201]
C255  100nF  [CAP-0201]
C256  100nF  [CAP-0201]
C257  100nF  [CAP-0201]
C258  1uF  [CAP-0201]
C259  1uF  [CAP-0201]
C260  10uF  [Cap-0402]
C261  10uF  [Cap-0402]
C262  4.7uF  [Cap-0402]
C263  4.7uF  [Cap-0402]
C264  100nF  [CAP-0201]
C265  100nF  [CAP-0201]
C266  1uF  [CAP-0201]
C267  1uF  [CAP-0201]
C268  1uF  [CAP-0201]
C269  1uF  [CAP-0201]
C270  1uF  [CAP-0201]
C271  1uF  [CAP-0201]
C272  1uF  [CAP-0201]
C273  100nF  [CAP-0201]
C274  1uF  [CAP-0201]
C275  100nF  [CAP-0201]
R79  240R  [Res-0402]
R80  240R  [Res-0402]
R81  240R  [Res-0402]
R82  240R  [Res-0402]
U10  RK3588  [FCBGA-1088L]  (parts A,B of 26)

### Nets
GND: C246.2 C247.2 C248.2 C250.2 C251.2 C252.2 C253.2 C254.2 C255.2 C256.2 C258.2 C259.2 C260.2 C261.2 C262.2 C263.2 C264.2 C265.2 C266.2 C267.2 C268.2 C269.2 C270.2 C271.2 C272.2 C273.2 C274.2 C275.2 U10.L16(DDR_CH1_PLL_AVSS) U10.M11(DDR_CH0_PLL_AVSS)
VCCA_1V8_S0: C268.1 C269.1 U10.K16(DDR_CH1_PLL_AVDD1V8) U10.M12(DDR_CH0_PLL_AVDD1V8)
VDD_DDR_S0: C260.1 C261.1 C262.1 C263.1 C264.1 C265.1 C272.1 C273.1 C274.1 C275.1 U10.L11(DDR_CH1_VDD_0) U10.L12(DDR_CH1_VDD_1) U10.L13(DDR_CH1_VDD_2) U10.L14(DDR_CH1_VDD_3) U10.L17(DDR_CH1_VDD_MIF_0) U10.L18(DDR_CH1_VDD_MIF_1) U10.N13(DDR_CH0_VDD_MIF_0) U10.P12(DDR_CH0_VDD_3) U10.P13(DDR_CH0_VDD_MIF_1) U10.R12(DDR_CH0_VDD_2) U10.T12(DDR_CH0_VDD_1) U10.U11(DDR_CH0_VDD_0)
VDDA_DDR_PLL_S0: C258.1 C259.1 U10.L15(DDR_CH1_PLL_DVDD) U10.N12(DDR_CH0_PLL_DVDD)
VDDQ_DDR_CK_S0: C266.1 C267.1 U10.L10(DDR_CH0_VDDQ_CK) U10.M13(DDR_CH1_VDDQ_CK)
VDDQ_DDR_CKE_S3: C270.1 C271.1 U10.H13(DDR_CH1_VDDQ_CKE) U10.N8(DDR_CH0_VDDQ_CKE)
VDDQ_DDR_S0: C246.1 C247.1 C248.1 C249.1 C250.1 C251.1 C252.1 C253.1 C254.1 C255.1 C256.1 C257.1 R79.2 R80.1 R81.2 R82.1 U10.K11(DDR_CH1_VDDQ_1) U10.K12(DDR_CH1_VDDQ_0) U10.K13(DDR_CH1_VDDQ_2) U10.K14(DDR_CH1_VDDQ_3) U10.K15(DDR_CH1_VDDQ_4) U10.M10(DDR_CH0_VDDQ_0) U10.N10(DDR_CH0_VDDQ_1) U10.P10(DDR_CH0_VDDQ_2) U10.R10(DDR_CH0_VDDQ_3) U10.T10(DDR_CH0_VDDQ_4)
DDR_CH0_A0_A: U10.T7(DDR_CH0_A0_A)
DDR_CH0_A0_B: U10.M8(DDR_CH0_A0_B)
DDR_CH0_A1_A: U10.T8(DDR_CH0_A1_A)
DDR_CH0_A1_B: U10.M5(DDR_CH0_A1_B)
DDR_CH0_A2_A: U10.P4(DDR_CH0_A2_A)
DDR_CH0_A2_B: U10.N5(DDR_CH0_A2_B)
DDR_CH0_A3_A: U10.P5(DDR_CH0_A3_A)
DDR_CH0_A3_B: U10.N4(DDR_CH0_A3_B)
DDR_CH0_A4_A: U10.R1(DDR_CH0_A4_A)
DDR_CH0_A4_B: U10.K1(DDR_CH0_A4_B)
DDR_CH0_A5_A: U10.P2(DDR_CH0_A5_A)
DDR_CH0_A5_B: U10.L2(DDR_CH0_A5_B)
DDR_CH0_A6_A: U10.T5(DDR_CH0_A6_A)
DDR_CH0_A6_B: U10.M7(DDR_CH0_A6_B)
DDR_CH0_CLKN_A: U10.N1(DDR_CH0_CKB_A)
DDR_CH0_CLKN_B: U10.M1(DDR_CH0_CKB_B)
DDR_CH0_CLKP_A: U10.N2(DDR_CH0_CK_A)
DDR_CH0_CLKP_B: U10.M2(DDR_CH0_CK_B)
DDR_CH0_DM0_A: U10.Y4(DDR_CH0_DM0_A)
DDR_CH0_DM0_B: U10.G4(DDR_CH0_DM0_B)
DDR_CH0_DM1_A: U10.AB4(DDR_CH0_DM1_A)
DDR_CH0_DM1_B: U10.E4(DDR_CH0_DM1_B)
DDR_CH0_DQ0_A: U10.U1(DDR_CH0_DQ0_A)
DDR_CH0_DQ0_B: U10.H1(DDR_CH0_DQ0_B)
DDR_CH0_DQ1_A: U10.T2(DDR_CH0_DQ1_A)
DDR_CH0_DQ1_B: U10.J2(DDR_CH0_DQ1_B)
DDR_CH0_DQ2_A: U10.T1(DDR_CH0_DQ2_A)
DDR_CH0_DQ2_B: U10.J1(DDR_CH0_DQ2_B)
DDR_CH0_DQ3_A: U10.R2(DDR_CH0_DQ3_A)
DDR_CH0_DQ3_B: U10.K2(DDR_CH0_DQ3_B)
DDR_CH0_DQ4_A: U10.W1(DDR_CH0_DQ4_A)
DDR_CH0_DQ4_B: U10.F1(DDR_CH0_DQ4_B)
DDR_CH0_DQ5_A: U10.V2(DDR_CH0_DQ5_A)
DDR_CH0_DQ5_B: U10.G2(DDR_CH0_DQ5_B)
DDR_CH0_DQ6_A: U10.V1(DDR_CH0_DQ6_A)
DDR_CH0_DQ6_B: U10.G1(DDR_CH0_DQ6_B)
DDR_CH0_DQ7_A: U10.U2(DDR_CH0_DQ7_A)
DDR_CH0_DQ7_B: U10.H2(DDR_CH0_DQ7_B)
DDR_CH0_DQ8_A: U10.AB2(DDR_CH0_DQ8_A)
DDR_CH0_DQ8_B: U10.D2(DDR_CH0_DQ8_B)
DDR_CH0_DQ9_A: U10.AB1(DDR_CH0_DQ9_A)
DDR_CH0_DQ9_B: U10.C1(DDR_CH0_DQ9_B)
DDR_CH0_DQ10_A: U10.AC1(DDR_CH0_DQ10_A)
DDR_CH0_DQ10_B: U10.C2(DDR_CH0_DQ10_B)
DDR_CH0_DQ11_A: U10.AC2(DDR_CH0_DQ11_A)
DDR_CH0_DQ11_B: U10.B1(DDR_CH0_DQ11_B)
DDR_CH0_DQ12_A: U10.Y1(DDR_CH0_DQ12_A)
DDR_CH0_DQ12_B: U10.F2(DDR_CH0_DQ12_B)
DDR_CH0_DQ13_A: U10.Y2(DDR_CH0_DQ13_A)
DDR_CH0_DQ13_B: U10.E1(DDR_CH0_DQ13_B)
DDR_CH0_DQ14_A: U10.AA1(DDR_CH0_DQ14_A)
DDR_CH0_DQ14_B: U10.E2(DDR_CH0_DQ14_B)
DDR_CH0_DQ15_A: U10.AA2(DDR_CH0_DQ15_A)
DDR_CH0_DQ15_B: U10.D1(DDR_CH0_DQ15_B)
DDR_CH0_DQS0N_A: U10.U4(DDR_CH0_DQS0N_A)
DDR_CH0_DQS0N_B: U10.J7(DDR_CH0_DQS0N_B)
DDR_CH0_DQS0P_A: U10.U5(DDR_CH0_DQS0P_A)
DDR_CH0_DQS0P_B: U10.J8(DDR_CH0_DQS0P_B)
DDR_CH0_DQS1N_A: U10.AA4(DDR_CH0_DQS1N_A)
DDR_CH0_DQS1N_B: U10.F4(DDR_CH0_DQS1N_B)
DDR_CH0_DQS1P_A: U10.AA5(DDR_CH0_DQS1P_A)
DDR_CH0_DQS1P_B: U10.F5(DDR_CH0_DQS1P_B)
DDR_CH0_LP4/4X_CKE0/LP5_CS0_A: U10.P7(DDR_CH0_LP4/4X_CKE0/LP5_CS0_A)
DDR_CH0_LP4/4X_CKE0/LP5_CS0_B: U10.L5(DDR_CH0_LP4/4X_CKE0/LP5_CS0_B)
DDR_CH0_LP4/4X_CKE1/LP5_CS1_A: U10.N7(DDR_CH0_LP4/4X_CKE1/LP5_CS1_A)
DDR_CH0_LP4/4X_CKE1/LP5_CS1_B: U10.L4(DDR_CH0_LP4/4X_CKE1/LP5_CS1_B)
DDR_CH0_LP4/4X_CS0_A: U10.R6(DDR_CH0_LP4/4X_CS0_A)
DDR_CH0_LP4/4X_CS0_B: U10.L7(DDR_CH0_LP4/4X_CS0_B)
DDR_CH0_LP4/4X_CS1_A: U10.R7(DDR_CH0_LP4/4X_CS1_A)
DDR_CH0_LP4/4X_CS1_B: U10.L8(DDR_CH0_LP4/4X_CS1_B)
DDR_CH0_WCK0N_A: U10.V6(DDR_CH0_WCK0N_A)
DDR_CH0_WCK0N_B: U10.K4(DDR_CH0_WCK0N_B)
DDR_CH0_WCK0P_A: U10.V7(DDR_CH0_WCK0P_A)
DDR_CH0_WCK0P_B: U10.K5(DDR_CH0_WCK0P_B)
DDR_CH0_WCK1N_A: U10.W5(DDR_CH0_WCK1N_A)
DDR_CH0_WCK1N_B: U10.H5(DDR_CH0_WCK1N_B)
DDR_CH0_WCK1P_A: U10.W4(DDR_CH0_WCK1P_A)
DDR_CH0_WCK1P_B: U10.H4(DDR_CH0_WCK1P_B)
DDR_CH1_A0_C: U10.G12(DDR_CH1_A0_C)
DDR_CH1_A0_D: U10.H15(DDR_CH1_A0_D)
DDR_CH1_A1_C: U10.F12(DDR_CH1_A1_C)
DDR_CH1_A1_D: U10.G14(DDR_CH1_A1_D)
DDR_CH1_A2_C: U10.E13(DDR_CH1_A2_C)
DDR_CH1_A2_D: U10.G13(DDR_CH1_A2_D)
DDR_CH1_A3_C: U10.D13(DDR_CH1_A3_C)
DDR_CH1_A3_D: U10.E14(DDR_CH1_A3_D)
DDR_CH1_A4_C: U10.A10(DDR_CH1_A4_C)
DDR_CH1_A4_D: U10.A15(DDR_CH1_A4_D)
DDR_CH1_A5_C: U10.B11(DDR_CH1_A5_C)
DDR_CH1_A5_D: U10.B14(DDR_CH1_A5_D)
DDR_CH1_A6_C: U10.D10(DDR_CH1_A6_C)
DDR_CH1_A6_D: U10.D14(DDR_CH1_A6_D)
DDR_CH1_CLKN_C: U10.A12(DDR_CH1_CKB_C)
DDR_CH1_CLKN_D: U10.A13(DDR_CH1_CKB_D)
DDR_CH1_CLKP_C: U10.B12(DDR_CH1_CK_C)
DDR_CH1_CLKP_D: U10.B13(DDR_CH1_CK_D)
DDR_CH1_DM0_C: U10.F8(DDR_CH1_DM0_C)
DDR_CH1_DM0_D: U10.D20(DDR_CH1_DM0_D)
DDR_CH1_DM1_C: U10.D4(DDR_CH1_DM1_C)
DDR_CH1_DM1_D: U10.D22(DDR_CH1_DM1_D)
DDR_CH1_DQ0_C: U10.A8(DDR_CH1_DQ0_C)
DDR_CH1_DQ0_D: U10.A17(DDR_CH1_DQ0_D)
DDR_CH1_DQ1_C: U10.B9(DDR_CH1_DQ1_C)
DDR_CH1_DQ1_D: U10.B16(DDR_CH1_DQ1_D)
DDR_CH1_DQ2_C: U10.A9(DDR_CH1_DQ2_C)
DDR_CH1_DQ2_D: U10.A16(DDR_CH1_DQ2_D)
DDR_CH1_DQ3_C: U10.B10(DDR_CH1_DQ3_C)
DDR_CH1_DQ3_D: U10.B15(DDR_CH1_DQ3_D)
DDR_CH1_DQ4_C: U10.A6(DDR_CH1_DQ4_C)
DDR_CH1_DQ4_D: U10.A19(DDR_CH1_DQ4_D)
DDR_CH1_DQ5_C: U10.B7(DDR_CH1_DQ5_C)
DDR_CH1_DQ5_D: U10.B18(DDR_CH1_DQ5_D)
DDR_CH1_DQ6_C: U10.A7(DDR_CH1_DQ6_C)
DDR_CH1_DQ6_D: U10.A18(DDR_CH1_DQ6_D)
DDR_CH1_DQ7_C: U10.B8(DDR_CH1_DQ7_C)
DDR_CH1_DQ7_D: U10.B17(DDR_CH1_DQ7_D)
DDR_CH1_DQ8_C: U10.A3(DDR_CH1_DQ8_C)
DDR_CH1_DQ8_D: U10.A22(DDR_CH1_DQ8_D)
DDR_CH1_DQ9_C: U10.B3(DDR_CH1_DQ9_C)
DDR_CH1_DQ9_D: U10.B22(DDR_CH1_DQ9_D)
DDR_CH1_DQ10_C: U10.A2(DDR_CH1_DQ10_C)
DDR_CH1_DQ10_D: U10.A23(DDR_CH1_DQ10_D)
DDR_CH1_DQ11_C: U10.B2(DDR_CH1_DQ11_C)
DDR_CH1_DQ11_D: U10.B23(DDR_CH1_DQ11_D)
DDR_CH1_DQ12_C: U10.A5(DDR_CH1_DQ12_C)
DDR_CH1_DQ12_D: U10.A20(DDR_CH1_DQ12_D)
DDR_CH1_DQ13_C: U10.B5(DDR_CH1_DQ13_C)
DDR_CH1_DQ13_D: U10.B20(DDR_CH1_DQ13_D)
DDR_CH1_DQ14_C: U10.A4(DDR_CH1_DQ14_C)
DDR_CH1_DQ14_D: U10.A21(DDR_CH1_DQ14_D)
DDR_CH1_DQ15_C: U10.B4(DDR_CH1_DQ15_C)
DDR_CH1_DQ15_D: U10.B21(DDR_CH1_DQ15_D)
DDR_CH1_DQS0N_C: U10.D9(DDR_CH1_DQS0N_C)
DDR_CH1_DQS0N_D: U10.G16(DDR_CH1_DQS0N_D)
DDR_CH1_DQS0P_C: U10.E9(DDR_CH1_DQS0P_C)
DDR_CH1_DQS0P_D: U10.H16(DDR_CH1_DQS0P_D)
DDR_CH1_DQS1N_C: U10.D5(DDR_CH1_DQS1N_C)
DDR_CH1_DQS1N_D: U10.E21(DDR_CH1_DQS1N_D)
DDR_CH1_DQS1P_C: U10.E5(DDR_CH1_DQS1P_C)
DDR_CH1_DQS1P_D: U10.D21(DDR_CH1_DQS1P_D)
DDR_CH1_LP4/4X_CKE0/LP5_CS0_C: U10.D11(DDR_CH1_LP4/4X_CKE0/LP5_CS0_C)
DDR_CH1_LP4/4X_CKE0/LP5_CS0_D: U10.D16(DDR_CH1_LP4/4X_CKE0/LP5_CS0_D)
DDR_CH1_LP4/4X_CKE1/LP5_CS1_C: U10.E11(DDR_CH1_LP4/4X_CKE1/LP5_CS1_C)
DDR_CH1_LP4/4X_CKE1/LP5_CS1_D: U10.E16(DDR_CH1_LP4/4X_CKE1/LP5_CS1_D)
DDR_CH1_LP4/4X_CS0_C: U10.G11(DDR_CH1_LP4/4X_CS0_C)
DDR_CH1_LP4/4X_CS0_D: U10.E19(DDR_CH1_LP4/4X_CS0_D)
DDR_CH1_LP4/4X_CS1_C: U10.H11(DDR_CH1_LP4/4X_CS1_C)
DDR_CH1_LP4/4X_CS1_D: U10.D19(DDR_CH1_LP4/4X_CS1_D)
DDR_CH1_WCK0N_C: U10.H9(DDR_CH1_WCK0N_C)
DDR_CH1_WCK0N_D: U10.D17(DDR_CH1_WCK0N_D)
DDR_CH1_WCK0P_C: U10.G9(DDR_CH1_WCK0P_C)
DDR_CH1_WCK0P_D: U10.E17(DDR_CH1_WCK0P_D)
DDR_CH1_WCK1N_C: U10.E7(DDR_CH1_WCK1N_C)
DDR_CH1_WCK1N_D: U10.G18(DDR_CH1_WCK1N_D)
DDR_CH1_WCK1P_C: U10.D7(DDR_CH1_WCK1P_C)
DDR_CH1_WCK1P_D: U10.H18(DDR_CH1_WCK1P_D)
DDR_RESET: U10.T4(DDR_CH0_RESET_A)
NetR79_1: R79.1 U10.W8(DDR_CH0_ZQ_A)
NetR80_2: R80.2 U10.H7(DDR_CH0_ZQ_B)
NetR81_1: R81.1 U10.G8(DDR_CH1_ZQ_C)
NetR82_2: R82.2 U10.F18(DDR_CH1_ZQ_D)

Not connected (* = marked no-connect by the designer): C249 2; C257 2; U10 C19(DDR_CH1_RESET_D)* E10(DDR_CH1_RESET_C)* K7(DDR_CH0_RESET_B)*

### Notes on the sheet
- (near U10) DDR Controller 0
- (near U10) DDR Controller 1
- (near C266) Place close to L10
- (near C267) Place close to M13
- File:
- Title:
- Date:
- Page
- Num:
- Total:
- Drawn By: Huzaifa Ali
- (in symbol RK3588, part A) DDR_PLL POWER; 0.75V-0.85V; LP4/4X_CKE&LP5_CS & Reset Power; 1.8V; LPDDR4/4X=1.1V; LPDDR5=1.05V; MEMORY INTERFACE POWER; CK Power; LPDDR4/4X=0.6V; LPDDR5=0.5V; DIGITAL CORE POWER; DDR IO POWER; (Except for ck, cke and reset)
- (in symbol RK3588, part B) DDR_PLL POWER; LP4/4X_CKE&LP5_CS & Reset Power; 0.75V-0.85V; LPDDR4/4X=1.1V; 1.8V; LPDDR5=1.05V; MEMORY INTERFACE POWER; CK Power; LPDDR4/4X=0.6V; LPDDR5=0.5V; DIGITAL CORE POWER; DDR IO POWER; (Except for ck, cke and reset)

### Library data of the parts
C246 C247 C260 C261 = AMK105CBJ106MV-F: CAP CER 10UF 4V X5R 0402; Manufacturer: Taiyo Yuden; Tolerance: 20%; Item Type: Capacitor; Supplier 1: Mouser; Manufacturer Part Number: AMK105CBJ106MV-F; RoHS: Yes; Category: Ceramic Capacitors; Stock 1: 507215; Pricing 1: 1=0.23000, 10=0.10300, 50=0.10300, 100=0.07800, 1000=0.04700, 10000=0.03900 (USD); Mount: Surface Mount; Case/Package: 0402; Case Code (Imperial): 0402; Case Code (Metric): 1005; Min Operating Temperature: -55°C; Max Operating Temperature: 85°C; Capacitance: 10uF; Dielectric: X5R; Package Quantity: 1; Packaging: Tape and Reel; Termination: SMD/SMT; Voltage Rating (DC): 4V; Voltage Rating: 4V; Series: M; Construction: Flat; Length: 0.039inch; Width: 0.02inch; Height: 0.5mm; Thickness: 0.028inch; RoHS Compliant: Yes; REACH SVHC: Unknown; Halogen Free: Halogen Free; ComponentLink1URL: https://datasheet.ciiva.com/6255/amk105cbj106mv-f-ss-6255363.pdf?src-supplier=Digi-Key; ComponentLink1Description: https://datasheet.ciiva.com/6255/amk105cbj106mv-f-ss-6255363.pdf?src-supplier=Digi-Key; ComponentLink2URL: https://datasheet.ciiva.com/30133/411amk105cbj106mv-f-30133635.pdf?src-supplier=Onlinecomponents.com; ComponentLink2Description: https://datasheet.ciiva.com/30133/411amk105cbj106mv-f-30133635.pdf?src-supplier=Onlinecomponents.com; ComponentLink3URL: https://datasheet.ciiva.com/15916/2amk105cbj106mv-f-15916827.pdf?src-supplier=Onlinecomponents.com; ComponentLink3Description: https://datasheet.ciiva.com/15916/2amk105cbj106mv-f-15916827.pdf?src-supplier=Onlinecomponents.com; Supplier Part Number 1: 963-AMK105CBJ106MV-F; LCSC Part Number: C454073
C248-C251 C258 C259 C266-C272 C274 = CC0201KRX5R5BB105: as C230 on sheet RK3588-OSC-PLL-PMUIO; Supplier 1: Digi-Key; Manufacturer Part Number: CC0201KRX5R5BB105; RoHS: Yes; Category: Ceramic Capacitors; Stock 1: 1909543; Pricing 1: 1=0.10000, 10=0.04600, 50=0.02500, 100=0.02050, 500=0.01464, 1000=0.01150, 2500=0.01045, 5000=0.00962 (USD); Mount: Surface Mount; Case/Package: 0201; Case Code (Imperial): 0201; Case Code (Metric): 0603; Min Operating Temperature: -55°C; Max Operating Temperature: 85°C; Packaging: Cut Tape; Capacitance: 1uF; Voltage Rating: 6.3V; RoHS Compliant: Yes; ComponentLink1URL: http://www.yageo.com/documents/recent/UPY-GPHC_X5R_4V-to-50V_25.pdf?src-supplier=Digi-Key; ComponentLink1Description: http://www.yageo.com/documents/recent/UPY-GPHC_X5R_4V-to-50V_25.pdf?src-supplier=Digi-Key; ComponentLink2URL: https://www.yageo.com/upload/media/product/productsearch/datasheet/mlcc/UPY-GPHC_X5R_4V-to-50V_26.pdf?src-supplier=Digi-Key; ComponentLink2Description: https://www.yageo.com/upload/media/product/productsearch/datasheet/mlcc/UPY-GPHC_X5R_4V-to-50V_26.pdf?src-supplier=Digi-Key; Supplier Part Number 1: 311-3471-1-ND
C252-C257 C264 C265 C273 C275 = CC0201KRX5R6BB104: as C232-C237 on sheet RK3588-OSC-PLL-PMUIO; Supplier 1: Mouser; Manufacturer Part Number: CC0201KRX5R6BB104; RoHS: Yes; Category: Ceramic Capacitors; Stock 1: 824403; Pricing 1: 1=0.10000, 10=0.02400, 50=0.02400, 100=0.01900, 1000=0.01100, 10000=0.00900 (USD); Mount: Surface Mount; Case/Package: 0201; Case Code (Imperial): 0201; Case Code (Metric): 0603; Weight: 6E-06oz; Min Operating Temperature: -55°C; Max Operating Temperature: 85°C; Capacitance: 100nF; Dielectric: X5R; Voltage Rating (DC): 10V; Packaging: Tape and Reel; Termination: SMD/SMT; Resistor Type: Ceramic; Voltage Rating: 10V; Series: CC; Construction: Flat; Length: 0.6mm; Width: 0.012inch; Height: 0.3mm; Thickness: 0.013inch; Depth: 0.3mm; Radiation Hardening: No; Lead Free: Lead Free; Halogen Free: Halogen Free; RoHS Compliant: Yes; ComponentLink1URL: https://datasheet.ciiva.com/11587/upy-gphc-x5r-4v-to-50v-12-11587190.pdf?src-supplier=Avnet; ComponentLink1Description: https://datasheet.ciiva.com/11587/upy-gphc-x5r-4v-to-50v-12-11587190.pdf?src-supplier=Avnet; Supplier Part Number 1: 603-CC201KRX5R6BB104; LCSC Part Number: C190183
C262 C263 = CC0402KRX5R5BB475: CAP CER 4.7UF 6.3V X5R 0402; Manufacturer: Yageo; Tolerance: 10%; Supplier 1: Digi-Key; Manufacturer Part Number: CC0402KRX5R5BB475; RoHS: Yes; Category: Ceramic Capacitors; Stock 1: 1127839; Pricing 1: 1=0.19000, 10=0.12700, 50=0.07600, 100=0.06420, 500=0.04396, 1000=0.03889, 2500=0.03720, 5000=0.03381 (USD); Case/Package: 0402; Voltage Rating (DC): 6.3V; Dielectric: X5R; Capacitance: 4.7uF; Lead Free: Lead Free; Halogen Free: Halogen Free; RoHS Compliant: Yes; ComponentLink1URL: http://www.yageo.com/documents/recent/UPY-GPHC_X5R_4V-to-50V_25.pdf?src-supplier=Digi-Key; ComponentLink1Description: http://www.yageo.com/documents/recent/UPY-GPHC_X5R_4V-to-50V_25.pdf?src-supplier=Digi-Key; ComponentLink2URL: https://www.yageo.com/upload/media/product/productsearch/datasheet/mlcc/UPY-GPHC_X5R_4V-to-50V_26.pdf?src-supplier=Digi-Key; ComponentLink2Description: https://www.yageo.com/upload/media/product/productsearch/datasheet/mlcc/UPY-GPHC_X5R_4V-to-50V_26.pdf?src-supplier=Digi-Key; Supplier Part Number 1: 311-3476-1-ND
R79-R82 = RC0402FR-07240RL: RES 240 OHM 1% 1/16W 0402; Manufacturer: Yageo; Power Rating: 63mW; Temperature Coefficient: 100ppm/°C; Voltage Rating (DC): 50V; Supplier 1: Mouser; Manufacturer Part Number: RC0402FR-07240RL; RoHS: Yes; Category: Chip SMD Resistors; Stock 1: 1903202; Pricing 1: 1=0.10000, 10=0.01200, 50=0.01200, 100=0.00500, 1000=0.00300, 10000=0.00100 (USD); Case/Package: 0402; Case Code (Metric): 1005; Case Code (Imperial): 0402; Size Code: 0402; Min Operating Temperature: -55°C; Max Operating Temperature: 155°C; Resistance: 240R; Tolerance: 1%; Packaging: Tape and Reel; Resistor Type: Thick Film; Voltage Rating: 50V; Package Quantity: 1; Number of Terminations: 2; Termination: SMD/SMT; Max Power Dissipation: 63mW; Features: Moisture Resistant; Series: RC; Construction: Rectangular; Resistance Tolerance: 1%; Length: 1mm; Width: 0.02inch; Height: 0.016inch; Depth: 0.5mm; REACH SVHC: Unknown; Lead Free: Lead Free; RoHS Compliant: Yes; Military Standard: Not; ComponentLink1URL: https://datasheet.ciiva.com/7849/1018594-7849915.pdf?src-supplier=Element14; ComponentLink1Description: https://datasheet.ciiva.com/7849/1018594-7849915.pdf?src-supplier=Element14; ComponentLink2URL: https://datasheet.ciiva.com/7849/1018594-7849916.pdf?src-supplier=Element14; ComponentLink2Description: https://datasheet.ciiva.com/7849/1018594-7849916.pdf?src-supplier=Element14; ComponentLink3URL: https://datasheet.ciiva.com/2519/pyu-r-int-thick-7-2519157.pdf?src-supplier=Digi-Key; ComponentLink3Description: https://datasheet.ciiva.com/2519/pyu-r-int-thick-7-2519157.pdf?src-supplier=Digi-Key; ComponentLink4URL: https://datasheet.ciiva.com/2519/pyu-r-int-thick-7-2519158.pdf?src-supplier=Digi-Key; ComponentLink4Description: https://datasheet.ciiva.com/2519/pyu-r-int-thick-7-2519158.pdf?src-supplier=Digi-Key; ComponentLink5URL: https://datasheet.ciiva.com/2519/pyu-r-int-thick-7-2519156.pdf?src-supplier=Digi-Key; ComponentLink5Description: https://datasheet.ciiva.com/2519/pyu-r-int-thick-7-2519156.pdf?src-supplier=Digi-Key; ComponentLink6URL: https://datasheet.ciiva.com/12669/pyu-rc0402-51-rohs-l-6-r-12669689.pdf?src-supplier=Mouser; ComponentLink6Description: https://datasheet.ciiva.com/12669/pyu-rc0402-51-rohs-l-6-r-12669689.pdf?src-supplier=Mouser; ComponentLink7URL: https://datasheet.ciiva.com/17419/pyu-rc0402-51-rohs-l-6-r-17419482.pdf?src-supplier=Future+Electronics; ComponentLink7Description: https://datasheet.ciiva.com/17419/pyu-rc0402-51-rohs-l-6-r-17419482.pdf?src-supplier=Future+Electronics; Supplier Part Number 1: 603-RC0402FR-07240RL
U10 = RK3588: as U10 on sheet RK3588-OSC-PLL-PMUIO; LCSC Part Number: *; Item Type: IC

## Sheet RK3588-EMMC-SD.SchDoc
size 420 x 297 mm; SheetNumber: 7; SheetTotal: 22
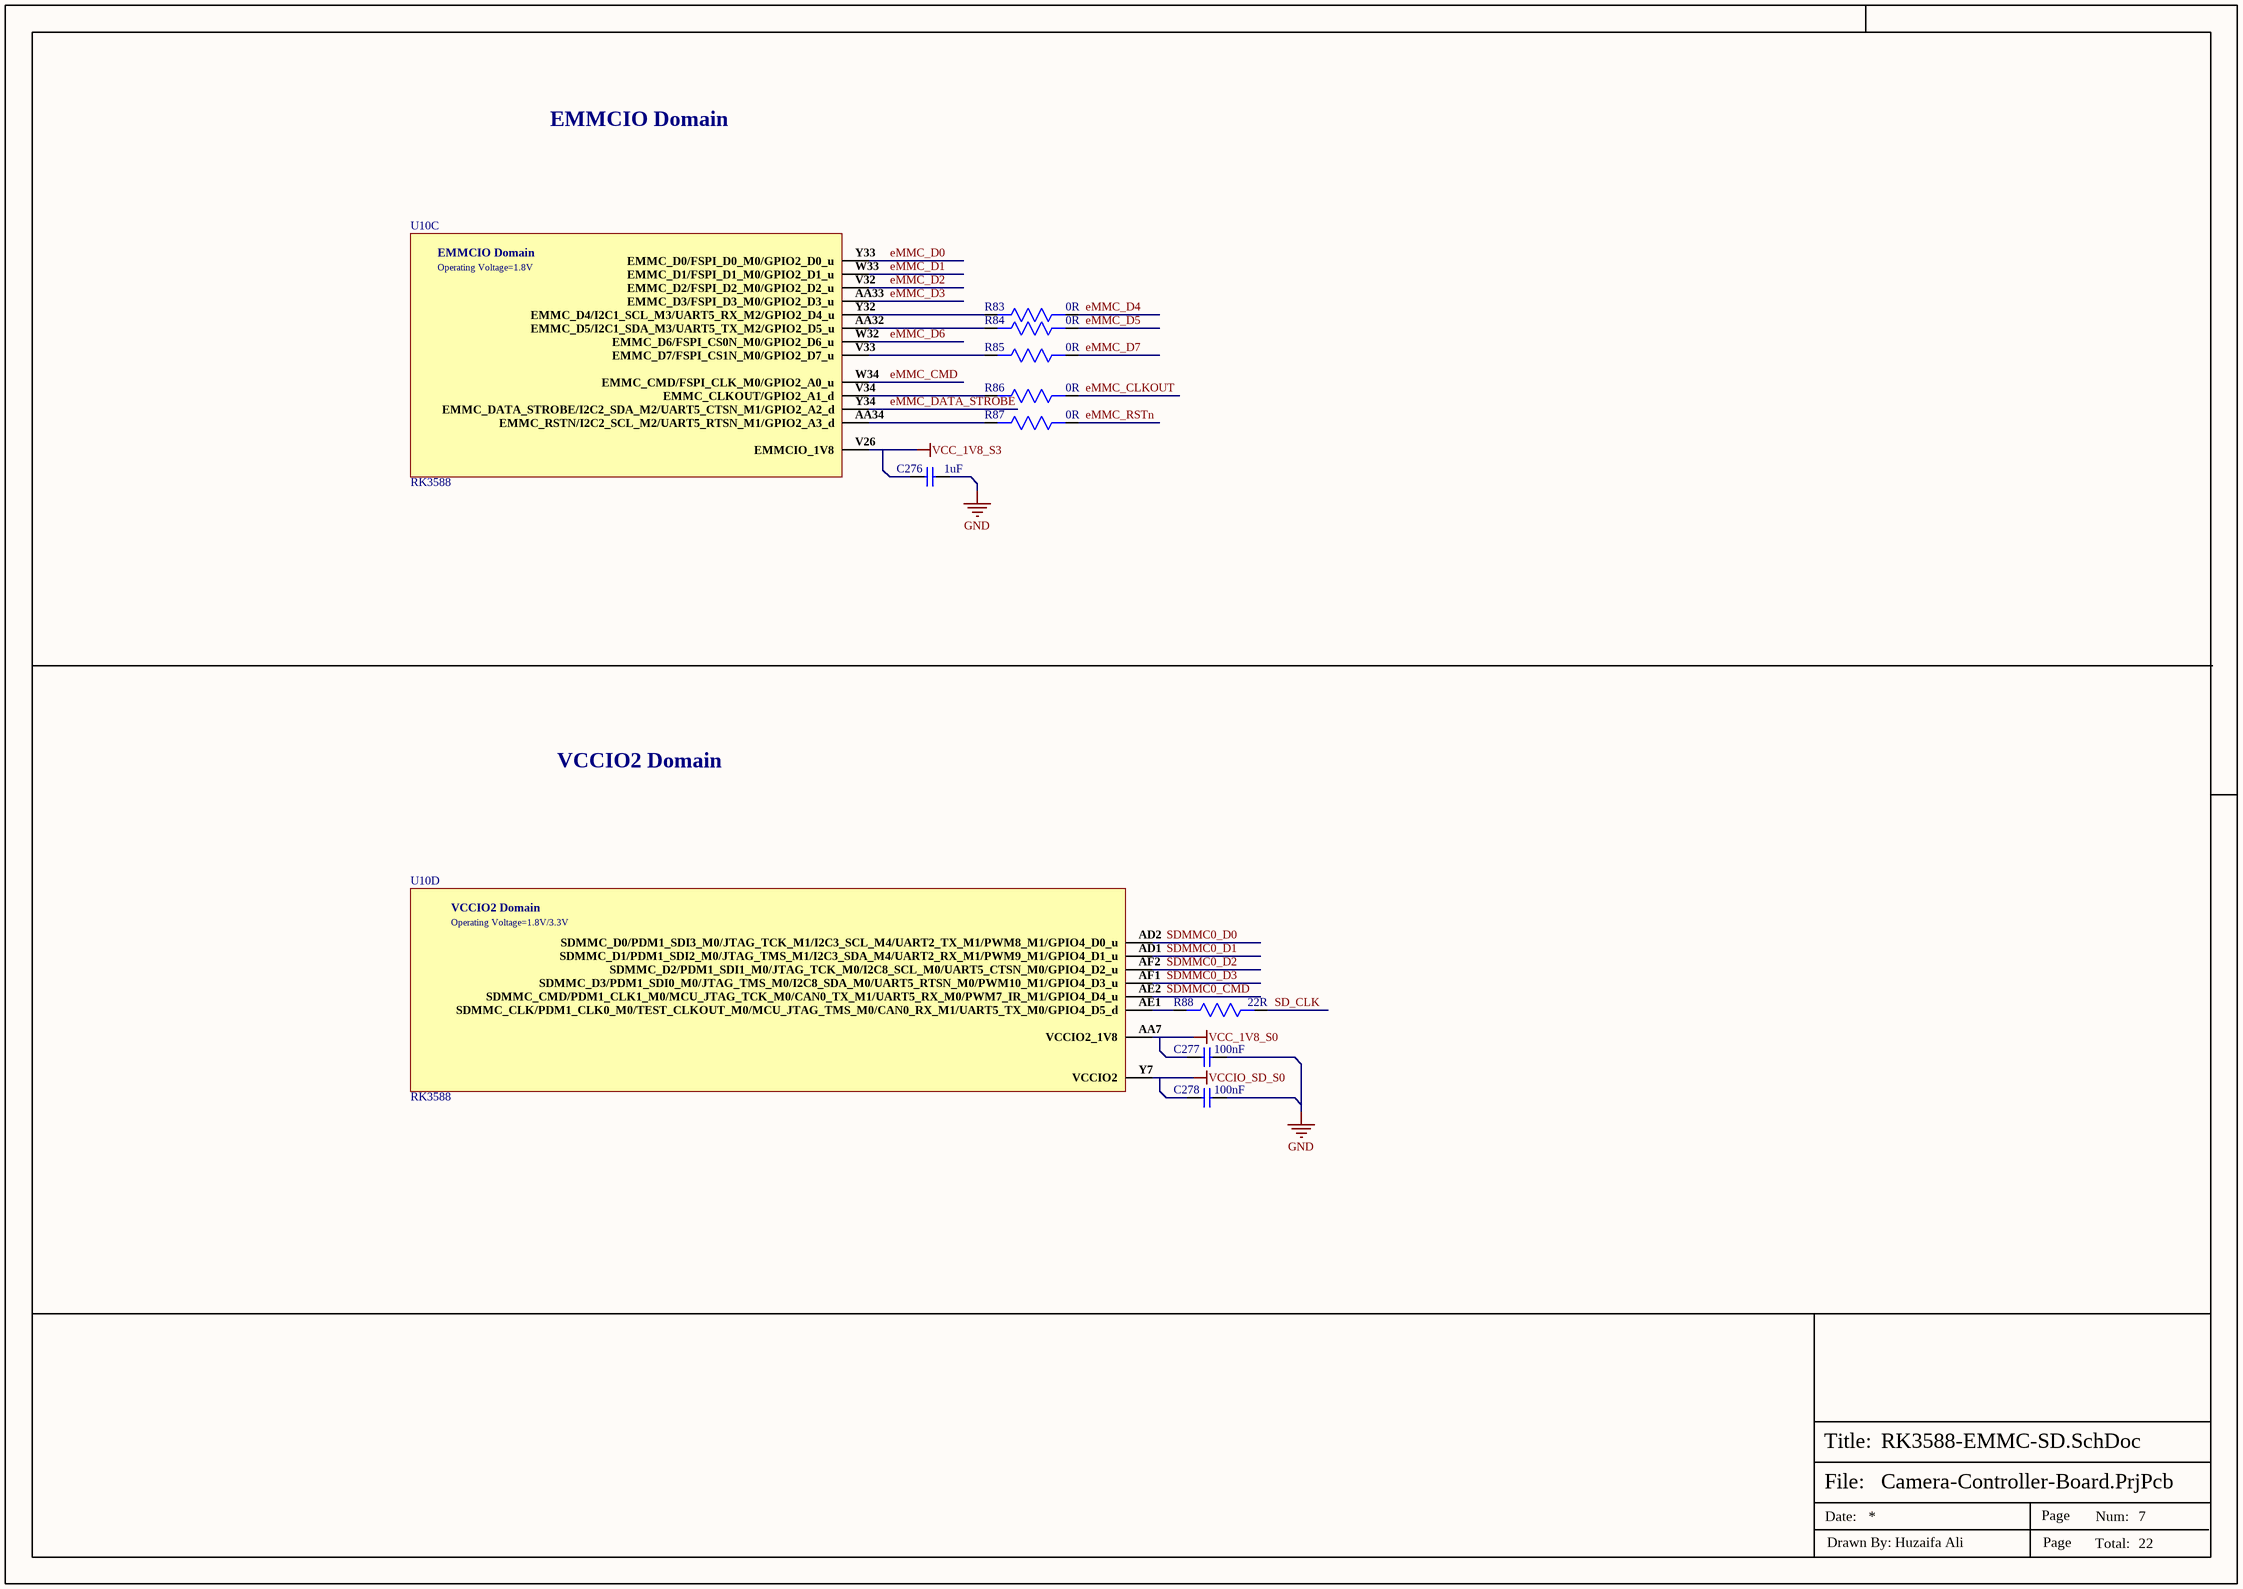
[diagram p6: RK3588-EMMC-SD.SchDoc]

### Parts
C276  1uF  [CAP-0201]
C277  100nF  [CAP-0201]
C278  100nF  [CAP-0201]
R83  0R  [Res-0201]
R84  0R  [Res-0201]
R85  0R  [Res-0201]
R86  0R  [Res-0201]
R87  0R  [Res-0201]
R88  22R  [Res-0402]
U10  RK3588  [FCBGA-1088L]  (parts C,D of 26)

### Nets
GND: C276.2 C277.2 C278.2
VCC_1V8_S0: C277.1 U10.AA7(VCCIO2_1V8)
VCC_1V8_S3: C276.1 U10.V26(EMMCIO_1V8)
VCCIO_SD_S0: C278.1 U10.Y7(VCCIO2)
eMMC_CLKOUT: R86.1
eMMC_CMD: U10.W34(EMMC_CMD/FSPI_CLK_M0/GPIO2_A0_u)
eMMC_D0: U10.Y33(EMMC_D0/FSPI_D0_M0/GPIO2_D0_u)
eMMC_D1: U10.W33(EMMC_D1/FSPI_D1_M0/GPIO2_D1_u)
eMMC_D2: U10.V32(EMMC_D2/FSPI_D2_M0/GPIO2_D2_u)
eMMC_D3: U10.AA33(EMMC_D3/FSPI_D3_M0/GPIO2_D3_u)
eMMC_D4: R83.1
eMMC_D5: R84.1
eMMC_D6: U10.W32(EMMC_D6/FSPI_CS0N_M0/GPIO2_D6_u)
eMMC_D7: R85.1
eMMC_DATA_STROBE: U10.Y34(EMMC_DATA_STROBE/I2C2_SDA_M2/UART5_CTSN_M1/GPIO2_A2_d)
eMMC_RSTn: R87.1
SD_CLK: R88.1
SDMMC0_CMD: U10.AE2(SDMMC_CMD/PDM1_CLK1_M0/MCU_JTAG_TCK_M0/CAN0_TX_M1/UART5_RX_M0/PWM7_IR_M1/GPIO4_D4_u)
SDMMC0_D0: U10.AD2(SDMMC_D0/PDM1_SDI3_M0/JTAG_TCK_M1/I2C3_SCL_M4/UART2_TX_M1/PWM8_M1/GPIO4_D0_u)
SDMMC0_D1: U10.AD1(SDMMC_D1/PDM1_SDI2_M0/JTAG_TMS_M1/I2C3_SDA_M4/UART2_RX_M1/PWM9_M1/GPIO4_D1_u)
SDMMC0_D2: U10.AF2(SDMMC_D2/PDM1_SDI1_M0/JTAG_TCK_M0/I2C8_SCL_M0/UART5_CTSN_M0/GPIO4_D2_u)
SDMMC0_D3: U10.AF1(SDMMC_D3/PDM1_SDI0_M0/JTAG_TMS_M0/I2C8_SDA_M0/UART5_RTSN_M0/PWM10_M1/GPIO4_D3_u)
NetR83_2: R83.2 U10.Y32(EMMC_D4/I2C1_SCL_M3/UART5_RX_M2/GPIO2_D4_u)
NetR84_2: R84.2 U10.AA32(EMMC_D5/I2C1_SDA_M3/UART5_TX_M2/GPIO2_D5_u)
NetR85_2: R85.2 U10.V33(EMMC_D7/FSPI_CS1N_M0/GPIO2_D7_u)
NetR86_2: R86.2 U10.V34(EMMC_CLKOUT/GPIO2_A1_d)
NetR87_2: R87.2 U10.AA34(EMMC_RSTN/I2C2_SCL_M2/UART5_RTSN_M1/GPIO2_A3_d)
NetR88_2: R88.2 U10.AE1(SDMMC_CLK/PDM1_CLK0_M0/TEST_CLKOUT_M0/MCU_JTAG_TMS_M0/CAN0_RX_M1/UART5_TX_M0/GPIO4_D5_d)

### Notes on the sheet
- EMMCIO Domain
- VCCIO2 Domain
- File:
- Title:
- Date:
- Page
- Num:
- Total:
- Drawn By: Huzaifa Ali
- (in symbol RK3588, part C) EMMCIO Domain; Operating Voltage=1.8V
- (in symbol RK3588, part D) VCCIO2 Domain; Operating Voltage=1.8V/3.3V

### Library data of the parts
C276 = CC0201MRX5R4BB105: CAP CER 1UF 4V X5R 0201; Manufacturer: Yageo; Tolerance: 20%; Supplier 1: Mouser; Manufacturer Part Number: CC0201MRX5R4BB105; RoHS: Yes; Category: Ceramic Capacitors; Stock 1: 61433; Pricing 1: 1=0.10000, 10=0.01500, 50=0.01500, 100=0.01300, 1000=0.00700, 10000=0.00500 (USD); Mount: Surface Mount; Case/Package: 0201; Case Code (Imperial): 0201; Case Code (Metric): 0603; Min Operating Temperature: -55°C; Max Operating Temperature: 85°C; Packaging: Tape and Reel; Capacitance: 1uF; Voltage Rating: 4V; RoHS Compliant: Yes; ComponentLink1URL: http://www.yageo.com/documents/recent/UPY-GPHC_X5R_4V-to-50V_25.pdf?src-supplier=Digi-Key; ComponentLink1Description: http://www.yageo.com/documents/recent/UPY-GPHC_X5R_4V-to-50V_25.pdf?src-supplier=Digi-Key; Supplier Part Number 1: 603-CC0201MRX54BB105
C277 C278 = CC0201KRX5R5BB104: as C244 on sheet RK3588-OSC-PLL-PMUIO; Supplier 1: Digi-Key; Manufacturer Part Number: CC0201KRX5R5BB104; RoHS: Yes; Category: Ceramic Capacitors; Stock 1: 3711589; Pricing 1: 1=0.10000, 10=0.02100, 50=0.01160, 100=0.00960, 500=0.00682, 1000=0.00536, 2500=0.00487, 5000=0.00448 (USD); Mount: Surface Mount; Case/Package: 0201; Number of Pins: 2; Case Code (Imperial): 0201; Case Code (Metric): 0603; Min Operating Temperature: -55°C; Max Operating Temperature: 85°C; Capacitance: 100nF; Dielectric: X5R; Voltage Rating: 6.3V; Packaging: Tape and Reel; Package Quantity: 1; Voltage Rating (DC): 6.3V; Termination: SMD/SMT; Resistor Type: Ceramic; Series: CC; Length: 0.6mm; Width: 0.012inch; Height: 0.3mm; Thickness: 0.013inch; Depth: 0.3mm; Reach SVHC Compliant: Yes; Lead Free: Lead Free; Halogen Free: Halogen Free; RoHS Compliant: Yes; ComponentLink1URL: https://datasheet.ciiva.com/7656/1525783-7656597.pdf?src-supplier=Element14; ComponentLink1Description: https://datasheet.ciiva.com/7656/1525783-7656597.pdf?src-supplier=Element14; ComponentLink2URL: https://datasheet.ciiva.com/28450/1359354-28450200.pdf?src-supplier=Element14; ComponentLink2Description: https://datasheet.ciiva.com/28450/1359354-28450200.pdf?src-supplier=Element14; ComponentLink3URL: https://datasheet.ciiva.com/176/mlccorderingcode-176766.pdf?src-supplier=Digi-Key; ComponentLink3Description: https://datasheet.ciiva.com/176/mlccorderingcode-176766.pdf?src-supplier=Digi-Key; ComponentLink4URL: https://datasheet.ciiva.com/176/mlccorderingcode-176765.pdf?src-supplier=Digi-Key; ComponentLink4Description: https://datasheet.ciiva.com/176/mlccorderingcode-176765.pdf?src-supplier=Digi-Key; ComponentLink5URL: https://datasheet.ciiva.com/176/mlccorderingcode-176767.pdf?src-supplier=Digi-Key; ComponentLink5Description: https://datasheet.ciiva.com/176/mlccorderingcode-176767.pdf?src-supplier=Digi-Key; Supplier Part Number 1: 311-1408-1-ND
R83-R87 = RC0201JR-070RL: as R66 on sheet RK3588-OSC-PLL-PMUIO; Supplier 1: Digi-Key; Manufacturer Part Number: RC0201JR-070RL; RoHS: Yes; Category: Chip SMD Resistors; Stock 1: 11079; Pricing 1: 1=0.10000, 10=0.03600, 25=0.02640, 50=0.02000, 100=0.01480, 250=0.01128, 500=0.00904, 1000=0.00665, 5000=0.00477 (USD); Case/Package: 0201; Contact Plating: Tin,Matte; Case Code (Metric): 0603; Case Code (Imperial): 0201; Weight: 6E-06oz; Size Code: 0201; Min Operating Temperature: -55°C; Max Operating Temperature: 125°C; Resistor Type: Thick Film; Resistance: 0R; Packaging: Tape and Reel; Package Quantity: 10000; Number of Terminations: 2; Termination: SMD/SMT; Max Power Dissipation: 50mW; Voltage Rating (DC): 25V; Features: Moisture Resistant; Series: RC; Construction: Rectangular; Resistance Tolerance: 5%; Length: 0.6mm; Width: 0.012inch; Height: 0.01inch; Depth: 0.3mm; Radiation Hardening: No; RoHS Compliant: Yes; REACH SVHC: Unknown; Military Standard: Not; Lead Free: Lead Free; ComponentLink1URL: https://datasheet.ciiva.com/7672/1563626-7672247.pdf?src-supplier=Element14; ComponentLink1Description: https://datasheet.ciiva.com/7672/1563626-7672247.pdf?src-supplier=Element14; ComponentLink2URL: https://datasheet.ciiva.com/7660/1421516-7660808.pdf?src-supplier=Element14; ComponentLink2Description: https://datasheet.ciiva.com/7660/1421516-7660808.pdf?src-supplier=Element14; ComponentLink3URL: https://datasheet.ciiva.com/7672/1563626-7672248.pdf?src-supplier=Element14; ComponentLink3Description: https://datasheet.ciiva.com/7672/1563626-7672248.pdf?src-supplier=Element14; ComponentLink4URL: https://datasheet.ciiva.com/16855/pyu-rc0201-51-rohs-l-8-16855994.pdf?src-supplier=Avnet+Europe; ComponentLink4Description: https://datasheet.ciiva.com/16855/pyu-rc0201-51-rohs-l-8-16855994.pdf?src-supplier=Avnet+Europe; ComponentLink5URL: https://datasheet.ciiva.com/28419/pyu-rc0201-51-rohs-l-8-28419660.pdf?src-supplier=Avnet+Europe; ComponentLink5Description: https://datasheet.ciiva.com/28419/pyu-rc0201-51-rohs-l-8-28419660.pdf?src-supplier=Avnet+Europe; ComponentLink6URL: https://datasheet.ciiva.com/46391/1421516-46391340.pdf?src-supplier=Element14; ComponentLink6Description: https://datasheet.ciiva.com/46391/1421516-46391340.pdf?src-supplier=Element14; ComponentLink7URL: https://datasheet.ciiva.com/8896/pyu-rc0201-51-rohs-l-8-8896143.pdf?src-supplier=Avnet; ComponentLink7Description: https://datasheet.ciiva.com/8896/pyu-rc0201-51-rohs-l-8-8896143.pdf?src-supplier=Avnet; Supplier Part Number 1: 311-0.0NCT-ND; LCSC Part Number: C106228
R88 = RCS040222R0FKED: as R65 on sheet RK3588-OSC-PLL-PMUIO; Supplier 1: Digi-Key; Manufacturer Part Number: RCS040222R0FKED; Stock 1: 8456; Pricing 1: 1=0.12, 10=0.105, 100=0.0402, 1000=0.01771, 2500=0.0153, 5000=0.01368 (USD); Case/Package: 0402; Case Code (Metric): 1005; Case Code (Imperial): 0402; Min Operating Temperature: -55°C; Max Operating Temperature: 155°C; Packaging: Tape and Reel; Resistance: 22R; Resistor Type: Thick Film; Number of Terminations: 2; Tolerance: 1%; Features: Automotive AEC-Q200; Length: 0.039inch; Width: 0.02inch; Height: 0.016inch; RoHS Compliant: Yes; ComponentLink1URL: http://www.vishay.com/docs/20065/rcse3.pdf?src-supplier=Digi-Key; ComponentLink1Description: http://www.vishay.com/docs/20065/rcse3.pdf?src-supplier=Digi-Key; Supplier Part Number 1: 541-2880-1-ND; LCSC Part Number: C2086081
U10 = RK3588: as U10 on sheet RK3588-OSC-PLL-PMUIO; LCSC Part Number: *; Item Type: IC